# Altium project Thunderscope_Rev5.3.PrjPcb (part 1 of 3)
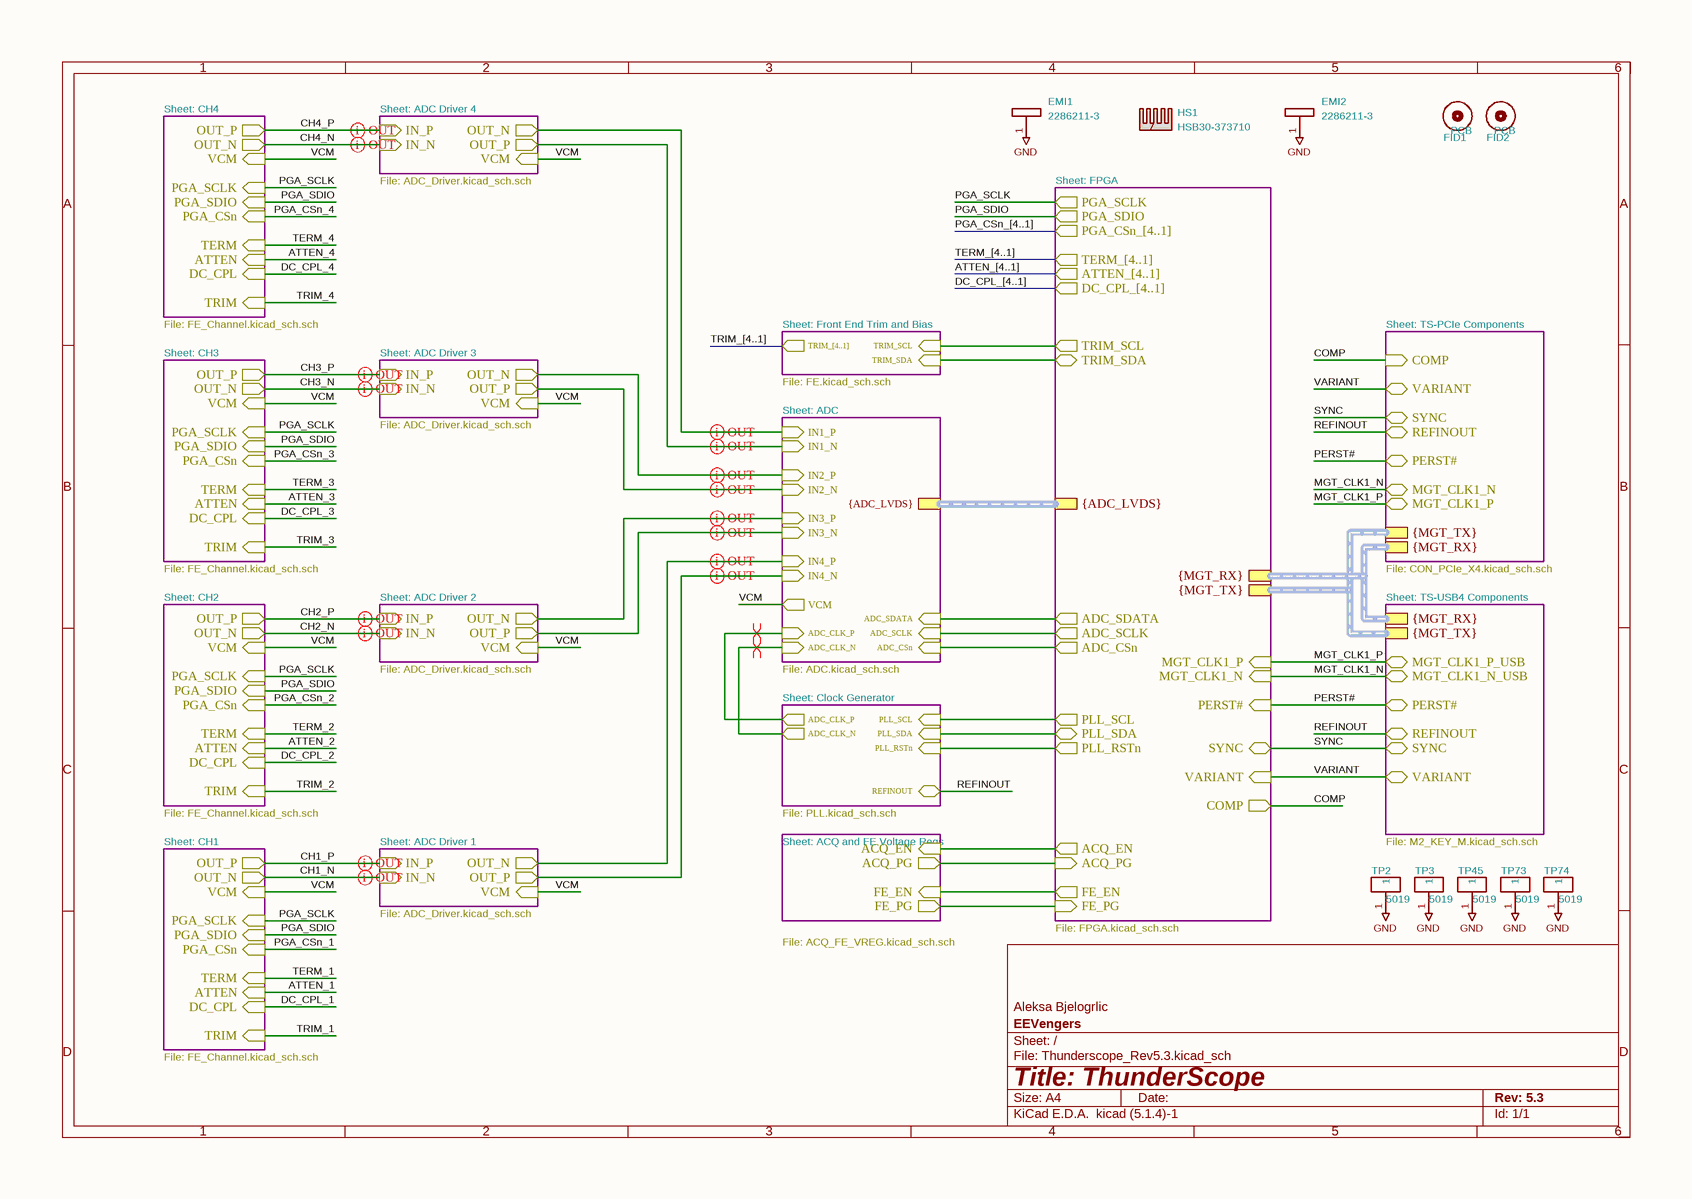
[diagram p0: Thunderscope_Rev5.3.SchDoc]
14 sheets, 945 parts. Net scope: hierarchical (ports join the sheet entries above them; power ports are global).
Board file: Thunderscope_Rev5.3.PcbDoc
Sheets:
  Thunderscope_Rev5.3.SchDoc
    CH3 = FE_Channel.SchDoc
    FPGA = FPGA.SchDoc
      FPGA Power Inputs = FPGA_PWR.SchDoc
      FPGA IO Banks = FPGA_Bank_IO.SchDoc
      FPGA Voltage Regs = FPGA_VREG.SchDoc
      FPGA Config and Transceivers = FPGA_CFG_MGT.SchDoc
    TS-USB4 Components = M2_KEY_M.SchDoc
    Clock Generator = PLL.SchDoc
    ADC Driver 1 = ADC_Driver.SchDoc
    ADC Driver 2 = ADC_Driver.SchDoc
    TS-PCIe Components = CON_PCIe_X4.SchDoc
    ADC = ADC.SchDoc
    Front End Trim and Bias = FE.SchDoc
    ADC Driver 3 = ADC_Driver.SchDoc
    CH4 = FE_Channel.SchDoc
    CH2 = FE_Channel.SchDoc
    ADC Driver 4 = ADC_Driver.SchDoc
    ACQ and FE Voltage Regs = ACQ_FE_VREG.SchDoc
    CH1 = FE_Channel.SchDoc

## Sheet Thunderscope_Rev5.3.SchDoc
size 297 x 209 mm

### Parts
EMI1  2286211-3  [TE_2286211-3]
EMI2  2286211-3  [TE_2286211-3]
FID1  PCB  [GEN_FID]
FID2  PCB  [GEN_FID]
HS1  HSB30-373710  [SSKY_HSB30-373710]  (mechanical)
TP2  5019  [KEY_5019]
TP3  5019  [KEY_5019]  (mechanical)
TP45  5019  [KEY_5019]  (mechanical)
TP73  5019  [KEY_5019]  (mechanical)
TP74  5019  [KEY_5019]  (mechanical)

### Sub-sheets
ACQ and FE Voltage Regs = ACQ_FE_VREG.SchDoc: FE_EN (in), ACQ_EN (in), FE_PG (out), ACQ_PG (out)
ADC = ADC.SchDoc: IN4_N (in), IN4_P (in), IN3_N (in), IN3_P (in), IN2_N (in), IN2_P (in), VCM (out), IN1_N (in), IN1_P (in), ADC_CSn (in), ADC_SDATA (in), ADC_SCLK (in), ADC_CLK_P (in), ADC_CLK_N (in), {ADC_LVDS} (harness ADC_LVDS)
ADC Driver 1 = ADC_Driver.SchDoc: VCM (in), OUT_N (out), OUT_P (out), IN_N (in), IN_P (in)
ADC Driver 2 = ADC_Driver.SchDoc: VCM (in), OUT_N (out), OUT_P (out), IN_N (in), IN_P (in)
ADC Driver 3 = ADC_Driver.SchDoc: VCM (in), OUT_N (out), OUT_P (out), IN_N (in), IN_P (in)
ADC Driver 4 = ADC_Driver.SchDoc: VCM (in), OUT_N (out), OUT_P (out), IN_N (in), IN_P (in)
CH1 = FE_Channel.SchDoc: OUT_P (out), VCM (in), OUT_N (out), TRIM (in), ATTEN (in), DC_CPL (in), PGA_CSn (in), PGA_SCLK (in), PGA_SDIO (in), TERM (in)
CH2 = FE_Channel.SchDoc: OUT_P (out), VCM (in), OUT_N (out), TRIM (in), ATTEN (in), DC_CPL (in), PGA_CSn (in), PGA_SCLK (in), PGA_SDIO (in), TERM (in)
CH3 = FE_Channel.SchDoc: OUT_P (out), VCM (in), OUT_N (out), TRIM (in), ATTEN (in), DC_CPL (in), PGA_CSn (in), PGA_SCLK (in), PGA_SDIO (in), TERM (in)
CH4 = FE_Channel.SchDoc: OUT_P (out), VCM (in), OUT_N (out), TRIM (in), ATTEN (in), DC_CPL (in), PGA_CSn (in), PGA_SCLK (in), PGA_SDIO (in), TERM (in)
Clock Generator = PLL.SchDoc: ADC_CLK_P (out), ADC_CLK_N (out), PLL_RSTn (in), PLL_SDA (in), PLL_SCL (in), REFINOUT (bidir)
FPGA = FPGA.SchDoc: PLL_RSTn (out), ADC_CSn (out), FE_EN (out), PGA_SDIO (out), PGA_SCLK (out), PLL_SCL (out), PLL_SDA (bidir), TRIM_SCL (out), TRIM_SDA (bidir), ADC_SDATA (out), ADC_SCLK (out), ACQ_EN (out), FE_PG (in), ACQ_PG (in), ATTEN_[4..1] (out), TERM_[4..1] (out), DC_CPL_[4..1] (out), PGA_CSn_[4..1] (out), SYNC (bidir), PERST# (in), MGT_CLK1_P (in), MGT_CLK1_N (in), VARIANT (in), COMP (out), {ADC_LVDS}, {MGT_TX}, {MGT_RX}
Front End Trim and Bias = FE.SchDoc: TRIM_SCL (in), TRIM_SDA (in), TRIM_[4..1] (out)
TS-PCIe Components = CON_PCIe_X4.SchDoc: PERST# (bidir), REFINOUT (bidir), SYNC (bidir), MGT_CLK1_N (bidir), MGT_CLK1_P (bidir), VARIANT (bidir), COMP (in), {MGT_RX} (harness MGT_RX), {MGT_TX} (harness MGT_TX)
TS-USB4 Components = M2_KEY_M.SchDoc: REFINOUT (bidir), SYNC (bidir), PERST# (bidir), MGT_CLK1_N_USB (bidir), MGT_CLK1_P_USB (bidir), VARIANT (bidir), {MGT_TX} (harness MGT_TX), {MGT_RX} (harness MGT_RX)

### Nets
GND: EMI1.1 EMI2.1 TP2.1 TP3.1 TP45.1 TP73.1 TP74.1
ACQ_EN: sheet FPGA/ACQ_EN, sheet ACQ and FE Voltage Regs/ACQ_EN
ACQ_PG: sheet FPGA/ACQ_PG, sheet ACQ and FE Voltage Regs/ACQ_PG
ADC_CLK_N: sheet Clock Generator/ADC_CLK_N, sheet ADC/ADC_CLK_N
ADC_CLK_P: sheet Clock Generator/ADC_CLK_P, sheet ADC/ADC_CLK_P
ADC_CSn: sheet FPGA/ADC_CSn, sheet ADC/ADC_CSn
ADC_SCLK: sheet FPGA/ADC_SCLK, sheet ADC/ADC_SCLK
ADC_SDATA: sheet FPGA/ADC_SDATA, sheet ADC/ADC_SDATA
CH1_N: sheet ADC Driver 1/IN_N, sheet CH1/OUT_N
CH1_P: sheet ADC Driver 1/IN_P, sheet CH1/OUT_P
CH2_N: sheet ADC Driver 2/IN_N, sheet CH2/OUT_N
CH2_P: sheet ADC Driver 2/IN_P, sheet CH2/OUT_P
CH3_N: sheet CH3/OUT_N, sheet ADC Driver 3/IN_N
CH3_P: sheet CH3/OUT_P, sheet ADC Driver 3/IN_P
CH4_N: sheet CH4/OUT_N, sheet ADC Driver 4/IN_N
CH4_P: sheet CH4/OUT_P, sheet ADC Driver 4/IN_P
COMP: sheet FPGA/COMP, sheet TS-PCIe Components/COMP
FE_EN: sheet FPGA/FE_EN, sheet ACQ and FE Voltage Regs/FE_EN
FE_PG: sheet FPGA/FE_PG, sheet ACQ and FE Voltage Regs/FE_PG
IN1_N: sheet ADC/IN1_N, sheet ADC Driver 4/OUT_P
IN1_P: sheet ADC/IN1_P, sheet ADC Driver 4/OUT_N
IN2_N: sheet ADC/IN2_N, sheet ADC Driver 3/OUT_P
IN2_P: sheet ADC/IN2_P, sheet ADC Driver 3/OUT_N
IN3_N: sheet ADC Driver 2/OUT_P, sheet ADC/IN3_N
IN3_P: sheet ADC Driver 2/OUT_N, sheet ADC/IN3_P
IN4_N: sheet ADC Driver 1/OUT_P, sheet ADC/IN4_N
IN4_P: sheet ADC Driver 1/OUT_N, sheet ADC/IN4_P
MGT_CLK1_N: sheet FPGA/MGT_CLK1_N, sheet TS-USB4 Components/MGT_CLK1_N_USB, sheet TS-PCIe Components/MGT_CLK1_N
MGT_CLK1_P: sheet FPGA/MGT_CLK1_P, sheet TS-USB4 Components/MGT_CLK1_P_USB, sheet TS-PCIe Components/MGT_CLK1_P
PERST#: sheet FPGA/PERST#, sheet TS-USB4 Components/PERST#, sheet TS-PCIe Components/PERST#
PGA_SCLK: sheet CH3/PGA_SCLK, sheet FPGA/PGA_SCLK, sheet CH4/PGA_SCLK, sheet CH2/PGA_SCLK, sheet CH1/PGA_SCLK
PGA_SDIO: sheet CH3/PGA_SDIO, sheet FPGA/PGA_SDIO, sheet CH4/PGA_SDIO, sheet CH2/PGA_SDIO, sheet CH1/PGA_SDIO
PLL_RSTn: sheet FPGA/PLL_RSTn, sheet Clock Generator/PLL_RSTn
PLL_SCL: sheet FPGA/PLL_SCL, sheet Clock Generator/PLL_SCL
PLL_SDA: sheet FPGA/PLL_SDA, sheet Clock Generator/PLL_SDA
REFINOUT: sheet TS-USB4 Components/REFINOUT, sheet Clock Generator/REFINOUT, sheet TS-PCIe Components/REFINOUT
SYNC: sheet FPGA/SYNC, sheet TS-USB4 Components/SYNC, sheet TS-PCIe Components/SYNC
TRIM_SCL: sheet FPGA/TRIM_SCL, sheet Front End Trim and Bias/TRIM_SCL
TRIM_SDA: sheet FPGA/TRIM_SDA, sheet Front End Trim and Bias/TRIM_SDA
VARIANT: sheet FPGA/VARIANT, sheet TS-USB4 Components/VARIANT, sheet TS-PCIe Components/VARIANT
VCM: sheet CH3/VCM, sheet ADC Driver 1/VCM, sheet ADC Driver 2/VCM, sheet ADC/VCM, sheet ADC Driver 3/VCM, sheet CH4/VCM, sheet CH2/VCM, sheet ADC Driver 4/VCM, sheet CH1/VCM

### Buses and harness runs
bus ATTEN_[4..1] = sheet FPGA/ATTEN_[4..1]
bus DC_CPL_[4..1] = sheet FPGA/DC_CPL_[4..1]
bus PGA_CSn_[4..1] = sheet FPGA/PGA_CSn_[4..1]
bus TERM_[4..1] = sheet FPGA/TERM_[4..1]
bus TRIM_[4..1] = sheet Front End Trim and Bias/TRIM_[4..1]
harness sheet ADC/{ADC_LVDS} = sheet FPGA/{ADC_LVDS}
harness sheet FPGA/{MGT_RX} = sheet TS-PCIe Components/{MGT_RX} = sheet TS-USB4 Components/{MGT_RX}
harness sheet FPGA/{MGT_TX} = sheet TS-PCIe Components/{MGT_TX} = sheet TS-USB4 Components/{MGT_TX}

### Layout directives
differential pair: ADC_CLK_N, ADC_CLK_P, IN1_N, IN1_P, IN2_N, IN2_P, IN3_N, IN3_P, IN4_N, IN4_P
differential pair; differential pair class 100Z_Diff_PGA: CH1_N, CH1_P, CH2_N, CH2_P, CH3_N, CH3_P, CH4_N, CH4_P

### Notes on the sheet
- Sheet: CH4
- Sheet: ADC Driver 4
- File: ADC_Driver.kicad_sch.sch
- Sheet: FPGA
- Sheet: CH3
- File: FE_Channel.kicad_sch.sch
- Sheet: ADC Driver 3
- Sheet: Front End Trim and Bias
- Sheet: TS-PCIe Components
- Sheet: ADC
- File: FE.kicad_sch.sch
- File: CON_PCIe_X4.kicad_sch.sch
- Sheet: CH2
- Sheet: ADC Driver 2
- Sheet: TS-USB4 Components
- Sheet: Clock Generator
- File: ADC.kicad_sch.sch
- Sheet: CH1
- Sheet: ADC Driver 1
- File: PLL.kicad_sch.sch
- Sheet: ACQ and FE Voltage Regs
- File: M2_KEY_M.kicad_sch.sch
- File: ACQ_FE_VREG.kicad_sch.sch
- File: FPGA.kicad_sch.sch
- 1
- 2
- 3
- 4
- 5
- 6
- A
- B
- C
- Aleksa Bjelogrlic
- D
- Title: ThunderScope
- File: Thunderscope_Rev5.3.kicad_sch
- Sheet: /
- EEVengers
- KiCad E.D.A.  kicad (5.1.4)-1
- Size: A4
- Date:
- Rev: 5.3
- Id: 1/1

### Library data of the parts
EMI1 EMI2 = EMI FINGER 2286211-3: MANUFACTURER: TE Connectivity; Substitutions Policy: No Substitutions; SUPPLIER 1: Mouser; SUPPLIER PART NUMBER 1: 571-2286211-3; MANUFACTURER PART NUMBER: 2286211-3; PACKAGE: Surface Mount; Footprint: Thunderscope_Rev5:TE_2286211-3; Value: 2286211-3
FID1 FID2 = FID 1mm: HOUSE PART NUMBER: Fiducial-1; Footprint: Thunderscope_Rev5:GEN_FID; Value: PCB
HS1 = HEATSINK HSB30-373710: MANUFACTURER: Same Sky; SUPPLIER 1: Mouser; SUPPLIER PART NUMBER 1: 179-HSB30-373710; MANUFACTURER PART NUMBER: HSB30-373710; Footprint: Thunderscope_Rev5:SSKY_HSB30-373710; Value: HSB30-373710
TP2 TP3 TP45 TP73 TP74 = TP KEYSTONE 5019: MANUFACTURER: Keystone Electronics; SUPPLIER 1: Mouser; SUPPLIER PART NUMBER 1: 534-5019; MANUFACTURER PART NUMBER: 5019; Footprint: Thunderscope_Rev5:KEY_5019; Value: 5019

## Sheet FE_Channel.SchDoc
size 420 x 297 mm
Used 4 times, as channels CH3, CH4, CH2, CH1. Parts and nets are listed once, with the designators drawn on the sheet.
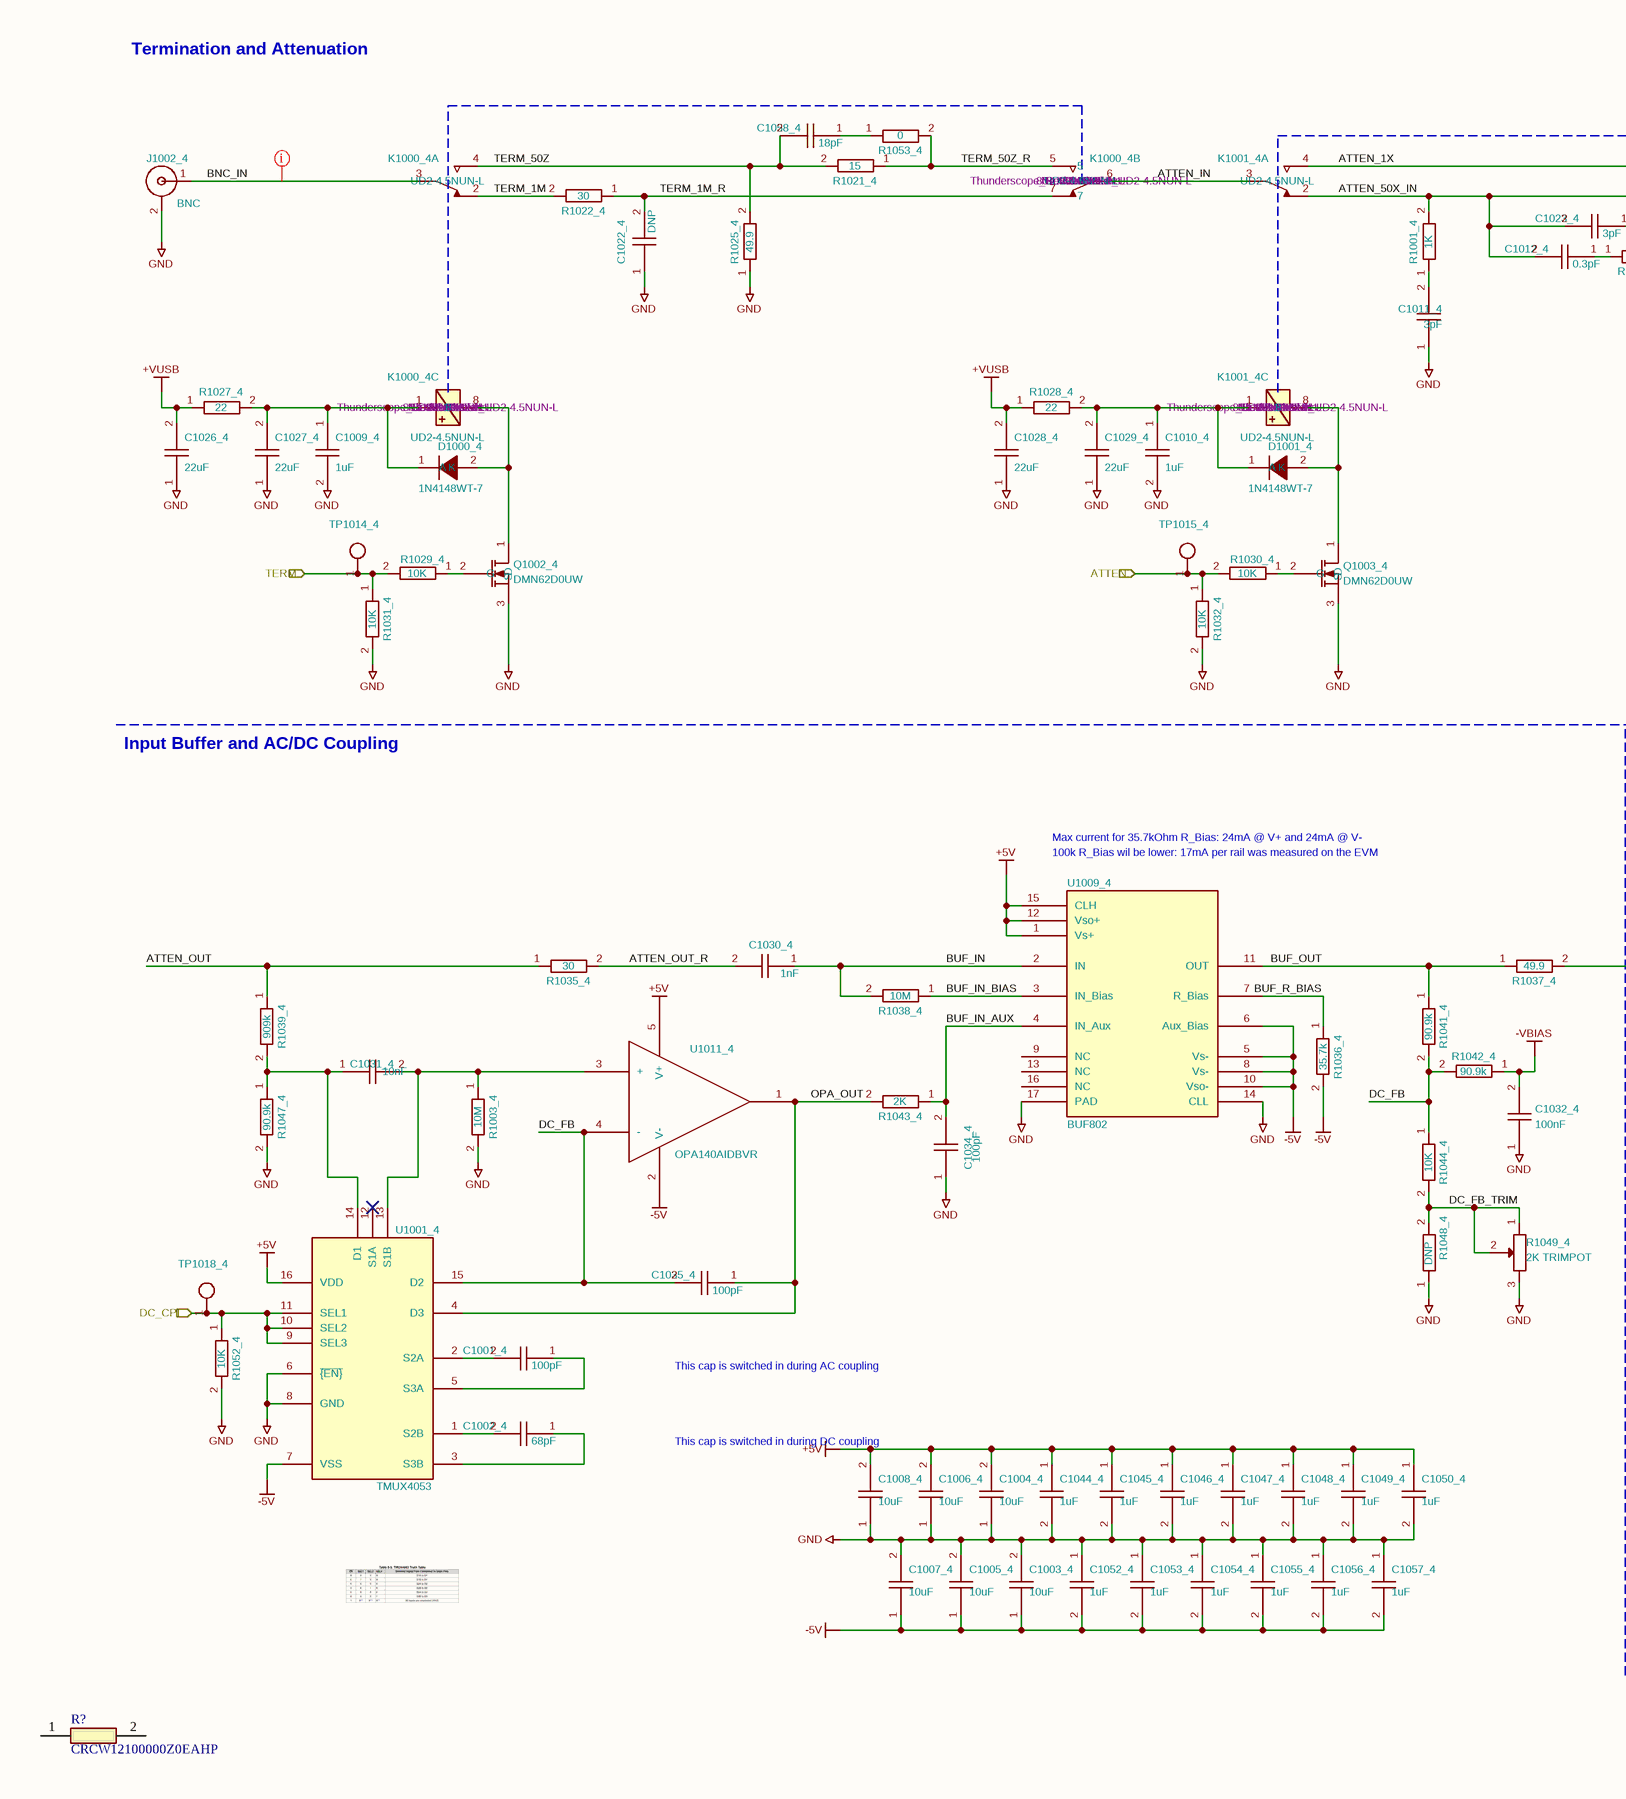
[diagram p1: FE_Channel.SchDoc, left]
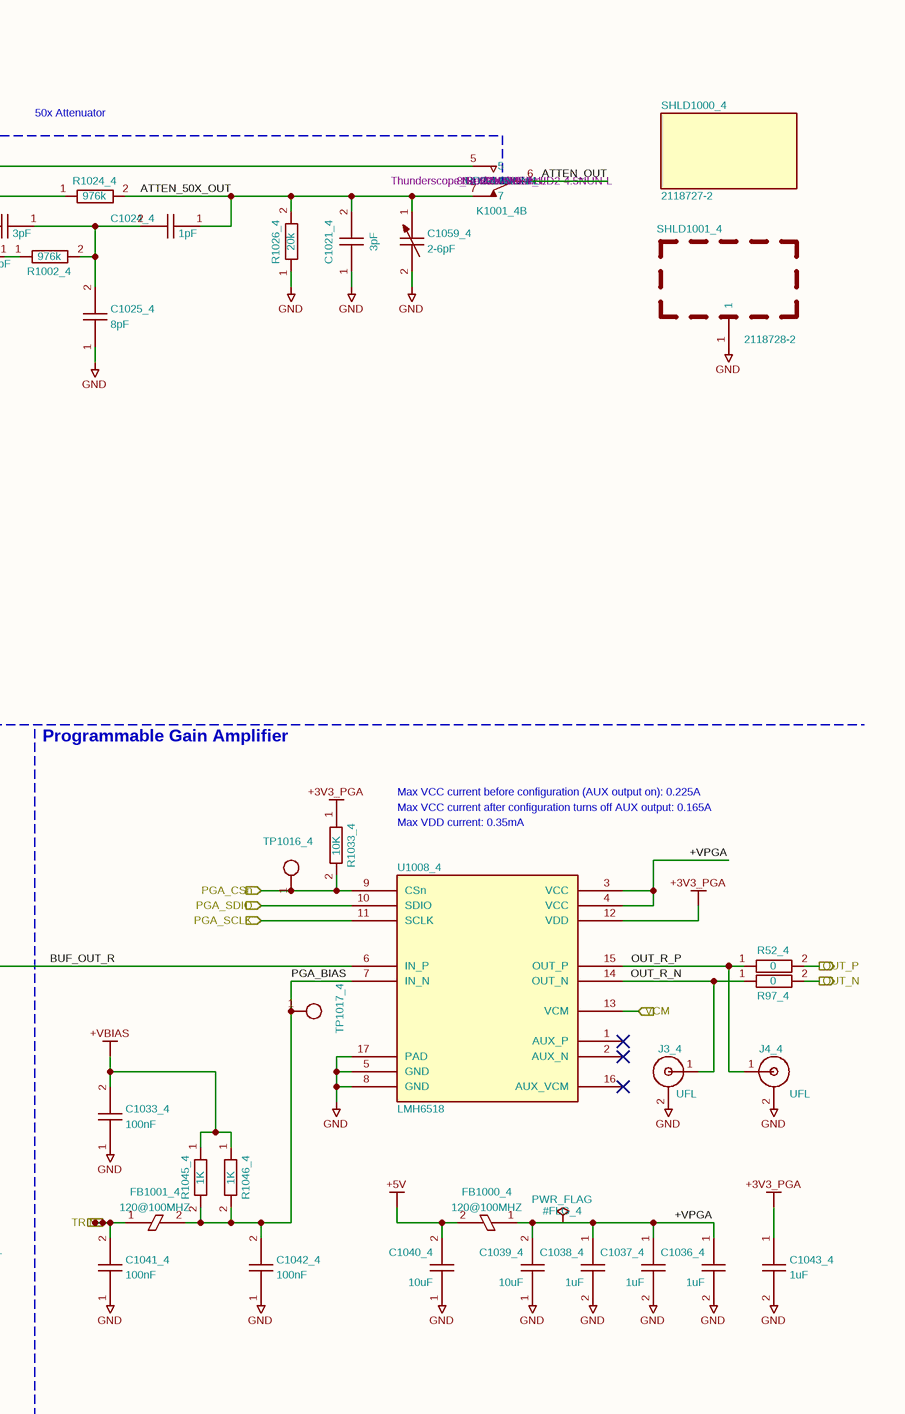
[diagram p2: FE_Channel.SchDoc, right]

### Parts
#FLG_4  PWR_FLAG  (graphical)
C1001_4  100pF  [GEN_C_0402]
C1002_4  68pF  [GEN_C_0402]
C1003_4  10uF  [GEN_C_0603]
C1004_4  10uF  [GEN_C_0603]
C1005_4  10uF  [GEN_C_0603]
C1006_4  10uF  [GEN_C_0603]
C1007_4  10uF  [GEN_C_0603]
C1008_4  10uF  [GEN_C_0603]
C1009_4  1uF  [GEN_C_0402]
C1010_4  1uF  [GEN_C_0402]
C1011_4  3pF  [GEN_C_0402]
C1012_4  0.3pF  [GEN_C_0402]
C1021_4  3pF  [GEN_C_0402]
C1022_4  DNP  [GEN_C_0603]
C1023_4  3pF  [GEN_C_0402]
C1024_4  1pF  [GEN_C_0402]
C1025_4  8pF  [GEN_C_0402]
C1026_4  22uF  [GEN_C_0805]
C1027_4  22uF  [GEN_C_0805]
C1028_4  22uF  [GEN_C_0805]
C1029_4  22uF  [GEN_C_0805]
C1030_4  1nF  [GEN_C_0603]
C1031_4  10nF  [GEN_C_0603]
C1032_4  100nF  [GEN_C_0402]
C1033_4  100nF  [GEN_C_0402]
C1034_4  100pF  [GEN_C_0402]
C1035_4  100pF  [GEN_C_0402]
C1036_4  1uF  [GEN_C_0402]
C1037_4  1uF  [GEN_C_0402]
C1038_4  1uF  [GEN_C_0402]
C1039_4  10uF  [GEN_C_0603]
C1040_4  10uF  [GEN_C_0603]
C1041_4  100nF  [GEN_C_0402]
C1042_4  100nF  [GEN_C_0402]
C1043_4  1uF  [GEN_C_0402]
C1044_4  1uF  [GEN_C_0402]
C1045_4  1uF  [GEN_C_0402]
C1046_4  1uF  [GEN_C_0402]
C1047_4  1uF  [GEN_C_0402]
C1048_4  1uF  [GEN_C_0402]
C1049_4  1uF  [GEN_C_0402]
C1050_4  1uF  [GEN_C_0402]
C1052_4  1uF  [GEN_C_0402]
C1053_4  1uF  [GEN_C_0402]
C1054_4  1uF  [GEN_C_0402]
C1055_4  1uF  [GEN_C_0402]
C1056_4  1uF  [GEN_C_0402]
C1057_4  1uF  [GEN_C_0402]
C1058_4  18pF  [GEN_C_0402]
C1059_4  2-6pF  [EW_TRIMCAP]
D1000_4  1N4148WT-7  [GEN_SOD_523]
D1001_4  1N4148WT-7  [GEN_SOD_523]
FB1000_4  120@100MHZ  [GEN_R_0402]
FB1001_4  120@100MHZ  [GEN_R_0402]
J3_4  UFL  [TE_2334884-1]
J4_4  UFL  [TE_2334884-1]
J1002_4  BNC  [DOSIN-801-0072]
K1000_4  UD2-4.5NUN-L  [KEMET_UD2-4.5NUN-L]  (parts A,B,C of 3)
K1001_4  UD2-4.5NUN-L  [KEMET_UD2-4.5NUN-L]  (parts A,B,C of 3)
Q1002_4  DMN62D0UW  [GEN_SOT_323]
Q1003_4  DMN62D0UW  [GEN_SOT_323]
R52_4  0  [GEN_R_0402]
R97_4  0  [GEN_R_0402]
R1001_4  1K  [GEN_R_0402]
R1002_4  976k  [GEN_R_0402]
R1003_4  10M  [GEN_R_0603]
R1021_4  15  [GEN_R_0603]
R1022_4  30  [GEN_R_0603]
R1024_4  976k  [GEN_R_0402]
R1025_4  49.9  [GEN_R_1206]
R1026_4  20k  [GEN_R_0402]
R1027_4  22  [GEN_R_0603]
R1028_4  22  [GEN_R_0603]
R1029_4  10K  [GEN_R_0402]
R1030_4  10K  [GEN_R_0402]
R1031_4  10K  [GEN_R_0402]
R1032_4  10K  [GEN_R_0402]
R1033_4  10K  [GEN_R_0402]
R1035_4  30  [GEN_R_0603]
R1036_4  35.7k  [GEN_R_0402]
R1037_4  49.9  [GEN_R_0402]
R1038_4  10M  [GEN_R_0603]
R1039_4  909k  [GEN_R_0402]
R1041_4  90.9k  [GEN_R_0402]
R1042_4  90.9k  [GEN_R_0402]
R1043_4  2K  [GEN_R_0402]
R1044_4  10K  [GEN_R_0402]
R1045_4  1K  [GEN_R_0402]
R1046_4  1K  [GEN_R_0402]
R1047_4  90.9k  [GEN_R_0402]
R1048_4  DNP  [GEN_R_0402]
R1049_4  2K TRIMPOT  [BOU_3mm_POT]
R1052_4  10K  [GEN_R_0402]
R1053_4  0  [GEN_R_0402]
R?  CRCW12100000Z0EAHP  [RESC3225X70N]
SHLD1000_4  2118727-2  (mechanical)
SHLD1001_4  2118728-2  [TE_2118728-2]
TP1014_4  PCB  [GEN_TP_PCB]  (value not drawn)
TP1015_4  PCB  [GEN_TP_PCB]  (value not drawn)
TP1016_4  PCB  [GEN_TP_PCB]  (value not drawn)
TP1017_4  PCB  [GEN_TP_PCB]  (value not drawn)
TP1018_4  PCB  [GEN_TP_PCB]  (value not drawn)
U1001_4  TMUX4053  [TI_TSOT-23-16_DYY0016A]
U1008_4  LMH6518  [TI_WQFN_RGH0016A]
U1009_4  BUF802  [TI_VQFN_RGT0016C]
U1011_4  OPA140AIDBVR  [GEN_SOT23_5_950_2900X1600X1450]

### Ports
ATTEN (in), DC_CPL (in), OUT_N (out), OUT_P (out), PGA_CSn (in), PGA_SCLK (in), PGA_SDIO (in), TERM (in), TRIM (in), VCM (in)

### Nets
+3V3_PGA: C1043_4.1 R1033_4.1 U1008_4.12(VDD)
+5V: C1004_4.2 C1006_4.2 C1008_4.2 C1040_4.2 C1044_4.1 C1045_4.1 C1046_4.1 C1047_4.1 C1048_4.1 C1049_4.1 C1050_4.1 FB1000_4.2 U1001_4.16(VDD) U1009_4.1(Vs+) U1009_4.12(Vso+) U1009_4.15(CLH) U1011_4.5(V+)
+VBIAS: C1033_4.2 R1045_4.1 R1046_4.1
+VUSB: C1026_4.2 C1028_4.2 R1027_4.1 R1028_4.1
-5V: C1003_4.1 C1005_4.1 C1007_4.1 C1052_4.2 C1053_4.2 C1054_4.2 C1055_4.2 C1056_4.2 C1057_4.2 R1036_4.2 U1001_4.7(VSS) U1009_4.5(Vs-) U1009_4.6(Aux_Bias) U1009_4.8(Vs-) U1009_4.10(Vso-) U1011_4.2(V-)
-VBIAS: C1032_4.2 R1042_4.1
GND: C1003_4.2 C1004_4.1 C1005_4.2 C1006_4.1 C1007_4.2 C1008_4.1 C1009_4.2 C1010_4.2 C1011_4.1 C1021_4.1 C1022_4.1 C1025_4.1 C1026_4.1 C1027_4.1 C1028_4.1 C1029_4.1 C1032_4.1 C1033_4.1 C1034_4.1 C1036_4.2 C1037_4.2 C1038_4.2 C1039_4.1 C1040_4.1 C1041_4.1 C1042_4.1 C1043_4.2 C1044_4.2 C1045_4.2 C1046_4.2 C1047_4.2 C1048_4.2 C1049_4.2 C1050_4.2 C1052_4.1 C1053_4.1 C1054_4.1 C1055_4.1 C1056_4.1 C1057_4.1 C1059_4.2 J3_4.2(SHIELD) J4_4.2(SHIELD) J1002_4.2(SHIELD) Q1002_4.3(S) Q1003_4.3(S) R1003_4.2 R1025_4.1 R1026_4.1 R1031_4.2 R1032_4.2 R1047_4.2 R1048_4.1 R1049_4.3 R1052_4.2 SHLD1001_4.1 U1001_4.6(~{{EN}}) U1001_4.8(GND) U1008_4.5(GND) U1008_4.8(GND) U1008_4.17(PAD) U1009_4.14(CLL) U1009_4.17(PAD)
+VPGA: #FLG_4.1 C1036_4.1 C1037_4.1 C1038_4.1 C1039_4.2 FB1000_4.1 U1008_4.3(VCC) U1008_4.4(VCC)
ATTEN: R1030_4.2 R1032_4.1 TP1015_4.1 ; port ATTEN
ATTEN_1X: K1001_4.4 K1001_4.5
ATTEN_50X_IN: C1012_4.2 C1023_4.2 K1001_4.2 R1001_4.2 R1024_4.1
ATTEN_50X_OUT: C1021_4.2 C1024_4.1 C1059_4.1 K1001_4.7 R1024_4.2 R1026_4.2
ATTEN_IN: K1000_4.6 K1001_4.3
ATTEN_OUT: K1001_4.6 R1035_4.1 R1039_4.1
ATTEN_OUT_R: C1030_4.2 R1035_4.2
BNC_IN: J1002_4.1(Signal) K1000_4.3
BUF_IN: C1030_4.1 R1038_4.2 U1009_4.2(IN)
BUF_IN_AUX: C1034_4.2 R1043_4.1 U1009_4.4(IN_Aux)
BUF_IN_BIAS: R1038_4.1 U1009_4.3(IN_Bias)
BUF_OUT: R1037_4.1 R1041_4.1 U1009_4.11(OUT)
BUF_OUT_R: R1037_4.2 U1008_4.6(IN_P)
BUF_R_BIAS: R1036_4.1 U1009_4.7(R_Bias)
DC_CPL: R1052_4.1 TP1018_4.1 U1001_4.9(SEL3) U1001_4.10(SEL2) U1001_4.11(SEL1) ; port DC_CPL
DC_FB: C1035_4.2 R1041_4.2 R1042_4.2 R1044_4.1 U1001_4.15(D2) U1011_4.4(-)
DC_FB_TRIM: R1044_4.2 R1048_4.2 R1049_4.1 R1049_4.2
OPA_OUT: C1035_4.1 R1043_4.2 U1001_4.4(D3) U1011_4.1(OUT)
OUT_N: R97_4.2 ; port OUT_N
OUT_P: R52_4.2 ; port OUT_P
OUT_R_N: J3_4.1(Signal) R97_4.1 U1008_4.14(OUT_N)
OUT_R_P: J4_4.1(Signal) R52_4.1 U1008_4.15(OUT_P)
PGA_BIAS: C1042_4.2 FB1001_4.2 R1045_4.2 R1046_4.2 TP1017_4.1 U1008_4.7(IN_N)
PGA_CSn: R1033_4.2 TP1016_4.1 U1008_4.9(CSn) ; port PGA_CSn
PGA_SCLK: U1008_4.11(SCLK) ; port PGA_SCLK
PGA_SDIO: U1008_4.10(SDIO) ; port PGA_SDIO
TERM: R1029_4.2 R1031_4.1 TP1014_4.1 ; port TERM
TERM_1M: K1000_4.2 R1022_4.2
TERM_1M_R: C1022_4.2 K1000_4.7 R1022_4.1
TERM_50Z: C1058_4.2 K1000_4.4 R1021_4.2 R1025_4.2
TERM_50Z_R: K1000_4.5 R1021_4.1 R1053_4.2
TRIM: C1041_4.2 FB1001_4.1 ; port TRIM
VCM: U1008_4.13(VCM) ; port VCM
NetC1001_4_1: C1001_4.1 U1001_4.5(S3A)
NetC1001_4_2: C1001_4.2 U1001_4.2(S2A)
NetC1002_4_1: C1002_4.1 U1001_4.3(S3B)
NetC1002_4_2: C1002_4.2 U1001_4.1(S2B)
NetC1009_4_1: C1009_4.1 C1027_4.2 D1000_4.1(K) K1000_4.1 R1027_4.2
NetC1010_4_1: C1010_4.1 C1029_4.2 D1001_4.1(K) K1001_4.1 R1028_4.2
NetC1011_4_2: C1011_4.2 R1001_4.1
NetC1012_4_1: C1012_4.1 R1002_4.1
NetC1023_4_1: C1023_4.1 C1024_4.2 C1025_4.2 R1002_4.2
NetC1031_4_1: C1031_4.1 R1039_4.2 R1047_4.1 U1001_4.14(D1)
NetC1031_4_2: C1031_4.2 R1003_4.1 U1001_4.13(S1B) U1011_4.3(+)
NetC1058_4_1: C1058_4.1 R1053_4.1
NetD1000_4_2: D1000_4.2(A) K1000_4.8 Q1002_4.1(D)
NetD1001_4_2: D1001_4.2(A) K1001_4.8 Q1003_4.1(D)
NetQ1002_4_2: Q1002_4.2(G) R1029_4.1
NetQ1003_4_2: Q1003_4.2(G) R1030_4.1

Not connected (* = marked no-connect by the designer): R? 1 2; U1001_4 12(S1A)*; U1008_4 1(AUX_P)* 2(AUX_N)* 16(AUX_VCM)*; U1009_4 9(NC) 13(NC) 16(NC)

### Channels
CH3: designators end in _CH3; ports ATTEN=ATTEN_3 DC_CPL=DC_CPL_3 OUT_N=CH3_N OUT_P=CH3_P PGA_CSn=PGA_CSn_3 PGA_SCLK=PGA_SCLK PGA_SDIO=PGA_SDIO TERM=TERM_3 TRIM=TRIM_3 VCM=VCM
CH4: designators end in _CH4; ports ATTEN=ATTEN_4 DC_CPL=DC_CPL_4 OUT_N=CH4_N OUT_P=CH4_P PGA_CSn=PGA_CSn_4 PGA_SCLK=PGA_SCLK PGA_SDIO=PGA_SDIO TERM=TERM_4 TRIM=TRIM_4 VCM=VCM
CH2: designators end in _CH2; ports ATTEN=ATTEN_2 DC_CPL=DC_CPL_2 OUT_N=CH2_N OUT_P=CH2_P PGA_CSn=PGA_CSn_2 PGA_SCLK=PGA_SCLK PGA_SDIO=PGA_SDIO TERM=TERM_2 TRIM=TRIM_2 VCM=VCM
CH1: designators end in _CH1; ports ATTEN=ATTEN_1 DC_CPL=DC_CPL_1 OUT_N=CH1_N OUT_P=CH1_P PGA_CSn=PGA_CSn_1 PGA_SCLK=PGA_SCLK PGA_SDIO=PGA_SDIO TERM=TERM_1 TRIM=TRIM_1 VCM=VCM

### Layout directives
net class 50Z: BNC_IN_CH3

### Notes on the sheet
- Termination and Attenuation
- 50x Attenuator
- Input Buffer and AC/DC Coupling
- Programmable Gain Amplifier
- Max current for 35.7kOhm R_Bias: 24mA @ V+ and 24mA @ V-
- (near U1009_4) 100k R_Bias wil be lower: 17mA per rail was measured on the EVM
- Max VDD current: 0.35mA
- Max VCC current before configuration (AUX output on): 0.225A
- Max VCC current after configuration turns off AUX output: 0.165A
- This cap is switched in
  during AC coupling
- This cap is switched in
  during DC coupling
- 1
- 2
- 3
- 4
- 5
- 6
- 7
- 8
- A
- B
- C
- D
- E
- Aleksa Bjelogrlic
- Title: ThunderScope
- File: FE_Channel.kicad_sch
- Sheet: /
- EEVengers
- F
- KiCad E.D.A.  kicad (5.1.4)-1
- Size: A3
- Date:
- Rev: 5.3
- Id: 1/1

### Library data of the parts
C1001_4 C1034_4 C1035_4 = CAP 100pF 50V C0G 0402: MANUFACTURER: Murata; MANUFACTURER PART NUMBER: GCM1555C1H101FA16D; TEMPERATURE COEFFICIENT: C0G; VOLTAGE RATING: 50V; Substitutions Policy: Any Parametric Equivalent; PACKAGE: 0402; SUPPLIER 1: Mouser; SUPPLIER PART NUMBER 1: 81-GCM1555C1H101FA6D; Value: 100pF; Footprint: Thunderscope_Rev5:GEN_C_0402
C1002_4 = CAP 68pF 50V C0G 0402: MANUFACTURER: Murata; MANUFACTURER PART NUMBER: GCM1555C1H680FA16J; TEMPERATURE COEFFICIENT: C0G; VOLTAGE RATING: 50V; Substitutions Policy: Any Parametric Equivalent; PACKAGE: 0402; SUPPLIER 1: Mouser; SUPPLIER PART NUMBER 1: 81-GCM1555C1H680FA6J; Value: 68pF; Footprint: Thunderscope_Rev5:GEN_C_0402
C1003_4 C1004_4 C1005_4 C1006_4 C1007_4 C1008_4 C1039_4 C1040_4 = CAP 10uF 25V X5R 0603: MANUFACTURER: Murata; MANUFACTURER PART NUMBER: GRM188R61E106MA73D; VOLTAGE RATING: 25V; Substitutions Policy: Any Parametric Equivalent; PACKAGE: 0402; SUPPLIER 1: Mouser; SUPPLIER PART NUMBER 1: 81-GRM188R61E106MA3D; Value: 10uF; Footprint: Thunderscope_Rev5:GEN_C_0603
C1009_4 C1010_4 C1036_4 C1037_4 C1038_4 C1043_4 C1044_4 C1045_4 C1046_4 C1047_4 C1048_4 C1049_4 C1050_4 C1052_4 C1053_4 C1054_4 C1055_4 C1056_4 C1057_4 = CAP 1uF 25V X5R 0402: MANUFACTURER: Murata; MANUFACTURER PART NUMBER: GRM155R61E105KA12D; VOLTAGE RATING: 25V; Substitutions Policy: Any Parametric Equivalent; PACKAGE: 0402; SUPPLIER 1: Mouser; SUPPLIER PART NUMBER 1: 81-GRM155R61E105KA2D; Value: 1uF; Footprint: Thunderscope_Rev5:GEN_C_0402
C1011_4 C1023_4 = CAP 3pF 200V C0G 0402: MANUFACTURER: KEMET; MANUFACTURER PART NUMBER: CBR04C309B2GAC; VOLTAGE RATING: 200V; Substitutions Policy: No Substitutions; TEMPERATURE COEFFICIENT: C0G; PACKAGE: 0402; SUPPLIER 1: Mouser; SUPPLIER PART NUMBER 1: 80-CBR04C309B2GAC; Value: 3pF; Footprint: Thunderscope_Rev5:GEN_C_0402
C1012_4 = CAP 0.3pF 100V Thin Film 0402: MANUFACTURER: KYOCERA AVX; MANUFACTURER PART NUMBER: 04021J0R3ZBSTR; VOLTAGE RATING: 100V; Substitutions Policy: No Substitutions; PACKAGE: 0402; SUPPLIER 1: Mouser; SUPPLIER PART NUMBER 1: 581-04021J0R3ZBSTR; Value: 0.3pF; Footprint: Thunderscope_Rev5:GEN_C_0402
C1021_4 = CAP 3pF 200V C0G 0402: MANUFACTURER: KEMET; MANUFACTURER PART NUMBER: CBR04C309B2GAC; VOLTAGE RATING: 200V; TEMPERATURE COEFFICIENT: C0G; Substitutions Policy: No Substitutions; PACKAGE: 0402; SUPPLIER 1: Mouser; SUPPLIER PART NUMBER 1: 80-CBR04C309B2GAC; Value: 3pF; Footprint: Thunderscope_Rev5:GEN_C_0402
C1022_4 = CAP DNP 0603: PACKAGE: 0603; Value: DNP; Footprint: Thunderscope_Rev5:GEN_C_0603
C1024_4 = CAP 1pF 50V C0G 0402: MANUFACTURER: KEMET; MANUFACTURER PART NUMBER: CBR04C109A5GAC; VOLTAGE RATING: 50V; Substitutions Policy: No Substitutions; PACKAGE: 0402; SUPPLIER 1: Mouser; SUPPLIER PART NUMBER 1: 80-CBR04C109A5GAC; Value: 1pF; Footprint: Thunderscope_Rev5:GEN_C_0402
C1025_4 = CAP 8pF 50V C0G 0402: MANUFACTURER: KEMET; MANUFACTURER PART NUMBER: CBR04C809B5GAC; VOLTAGE RATING: 50V; TEMPERATURE COEFFICIENT: C0G; Substitutions Policy: No Substitutions; PACKAGE: 0402; SUPPLIER 1: Mouser; SUPPLIER PART NUMBER 1: 80-CBR04C809B5GAC; Value: 8pF; Footprint: Thunderscope_Rev5:GEN_C_0402
C1026_4 C1027_4 C1028_4 C1029_4 = CAP 22uF 25V X5R 0805: HOUSE PART NUMBER: C-22uF-0805-002; MANUFACTURER: Murata; MANUFACTURER PART NUMBER: GRM21BR61E226ME44L; VOLTAGE RATING: 25V; Substitutions Policy: Any Parametric Equivalent; PACKAGE: 0805; SUPPLIER 1: Mouser; SUPPLIER PART NUMBER 1: 81-GRM21BR61E226ME4L; Value: 22uF; Footprint: Thunderscope_Rev5:GEN_C_0805
C1030_4 = CAP 1nF 100V C0G 0603: MANUFACTURER: Murata; MANUFACTURER PART NUMBER: GCM1885C2A102FA16D; VOLTAGE RATING: 100V; TEMPERATURE COEFFICIENT: C0G; Substitutions Policy: ECO Required for Substitution; PACKAGE: 0603; SUPPLIER 1: Mouser; SUPPLIER PART NUMBER 1: 81-GCM1885C2A102FA6D; Value: 1nF; Footprint: Thunderscope_Rev5:GEN_C_0603
C1031_4 = CAP 10nF 50V C0G 0603: MANUFACTURER: Murata; MANUFACTURER PART NUMBER: GRM1885C1H103JA01J; VOLTAGE RATING: 50V; Substitutions Policy: ECO Required for Substitution; PACKAGE: 0603; SUPPLIER 1: Mouser; SUPPLIER PART NUMBER 1: 81-GRM1885C1H103JA1J; Value: 10nF; Footprint: Thunderscope_Rev5:GEN_C_0603
C1032_4 C1033_4 C1041_4 C1042_4 = CAP 100nF 16V X7R 0402: HOUSE PART NUMBER: C-100nF-0402-002; MANUFACTURER: Murata; MANUFACTURER PART NUMBER: GCM155R71C104KA55D; VOLTAGE RATING: 16V; Substitutions Policy: Any Parametric Equivalent; PACKAGE: 0402; SUPPLIER 1: Mouser; SUPPLIER PART NUMBER 1: 81-GCM155R71C104KA5D; Value: 100nF; Footprint: Thunderscope_Rev5:GEN_C_0402
C1058_4 = CAP 18pF 50V C0G 0402: MANUFACTURER: KEMET; MANUFACTURER PART NUMBER: CBR04C180F5GAC; VOLTAGE RATING: 50V; TEMPERATURE COEFFICIENT: C0G; Substitutions Policy: No Substitutions; PACKAGE: 0402; SUPPLIER 1: Mouser; SUPPLIER PART NUMBER 1: 80-CBR04C180F5G; Value: 18pF; Footprint: Thunderscope_Rev5:GEN_C_0402
C1059_4 = CAP TRIMMER 2-6PF 100V: MANUFACTURER: EW Electronics; MANUFACTURER PART NUMBER: SGC3S060; Substitutions Policy: ECO Required for Substitution; SUPPLIER 1: Digikey; SUPPLIER PART NUMBER 1: 2447-SGC3S060CT-ND; PACKAGE: 2-SMD (4.5x3.2mm); Value: 2-6pF; Footprint: Thunderscope_Rev5:EW_TRIMCAP
D1000_4 D1001_4 = DIODE 1N4148: MANUFACTURER: Diodes; Substitutions Policy: ECO Required for Substitution; SUPPLIER 1: Mouser; SUPPLIER PART NUMBER 1: 621-1N4148WT; MANUFACTURER PART NUMBER: 1N4148WT-7; PACKAGE: SOD-523; Value: 1N4148WT-7; Footprint: Thunderscope_Rev5:GEN_SOD_523
FB1000_4 FB1001_4 = FERRITE BEAD 120 OHM 0402: HOUSE PART NUMBER: BLM15PX121SN1D; MANUFACTURER: Murata; Substitutions Policy: No Substitutions; SUPPLIER 1: Mouser; SUPPLIER PART NUMBER 1: 81-BLM15PX121SN1D; MANUFACTURER PART NUMBER: BLM15PX121SN1D; PACKAGE: 0402; Value: 120@100MHZ; Footprint: Thunderscope_Rev5:GEN_R_0402
J3_4 J4_4 = UFL Jack SMD: MANUFACTURER: TE Connectivity; MANUFACTURER PART NUMBER: 2334884-1; SUPPLIER 1: Mouser; SUPPLIER PART NUMBER 1: 571-2334884-1; PACKAGE: Surface Mount; Value: UFL; Footprint: Thunderscope_Rev5:TE_2334884-1
J1002_4 = BNC JACK R/A: MANUFACTURER: Molex; MANUFACTURER PART NUMBER: 73100-0105; Substitutions Policy: No Substitutions; SUPPLIER 1: Mouser; SUPPLIER PART NUMBER 1: 538-73100-0105; PACKAGE: Through Hole; Value: BNC; Footprint: Thunderscope_Rev5:MOL_0731000105
K1000_4 K1001_4 = RELAY DPDT-NO UD2-4.5NUN-L: MANUFACTURER: KEMET; Substitutions Policy: No Substitutions; MANUFACTURER PART NUMBER: UD2-4.5NUN-L; SUPPLIER 1: Mouser; SUPPLIER PART NUMBER 1: 80-UD2-4.5NUN-L; PACKAGE: Surface Mount; Value: UD2-4.5NUN-L; Footprint: Thunderscope_Rev5:KEMET_UD2-4.5NUN-L
Q1002_4 Q1003_4 = NMOS DMN62D0UW: HOUSE PART NUMBER: DMN62D0UW-7; MANUFACTURER: Diodes; VDSS: 60V; Substitutions Policy: ECO Required for Substitution; SUPPLIER 1: Mouser; SUPPLIER PART NUMBER 1: 621-DMN62D0UW-7; MANUFACTURER PART NUMBER: DMN62D0UW-7; PACKAGE: SOT-323; Value: DMN62D0UW; Footprint: Thunderscope_Rev5:GEN_SOT_323
R52_4 R97_4 R1053_4 = RES 0 OHM 1/16W 0402: MANUFACTURER: Yageo; MANUFACTURER PART NUMBER: RC0402JR-070RL; Substitutions Policy: Any Parametric Equivalent; PACKAGE: 0402; SUPPLIER 1: Mouser; SUPPLIER PART NUMBER 1: 603-RC0402JR-070RL; Value: 0; Footprint: Thunderscope_Rev5:GEN_R_0402
R1001_4 R1045_4 R1046_4 = RES 1K OHM 1% 1/10W 0402: HOUSE PART NUMBER: R-1K-0402-1%-001; MANUFACTURER: Yageo; MANUFACTURER PART NUMBER: RC0402FR-071KL; TOLERANCE: 1%; Substitutions Policy: Any Parametric Equivalent; PACKAGE: 0402; SUPPLIER 1: Mouser; SUPPLIER PART NUMBER 1: 603-RC0402FR-071KL; Value: 1K; Footprint: Thunderscope_Rev5:GEN_R_0402
R1002_4 R1024_4 = RES 976k OHM 1% 1/10W 0402: MANUFACTURER: KOA Speer; MANUFACTURER PART NUMBER: RK73H1ETTP9763F; TOLERANCE: 1%; Substitutions Policy: ECO Required for Substitution; PACKAGE: 0402; SUPPLIER 1: Mouser; SUPPLIER PART NUMBER 1: 660-RK73H1ETTP9763F; Value: 976k; Footprint: Thunderscope_Rev5:GEN_R_0402
R1003_4 R1038_4 = RES 10M OHM 1% 1/10W 0603: MANUFACTURER: KOA Speer; MANUFACTURER PART NUMBER: RK73H1JTTD1005F; TOLERANCE: 1%; Substitutions Policy: No Substitutions; PACKAGE: 0603; SUPPLIER 1: Mouser; SUPPLIER PART NUMBER 1: 660-RK73H1JTTD1005F; Value: 10M; Footprint: Thunderscope_Rev5:GEN_R_0603
R1021_4 = RES 15 OHM 1% 1/3W 0603: MANUFACTURER: KOA Speer; MANUFACTURER PART NUMBER: SG73P1JTTD15R0F; TOLERANCE: 1%; Substitutions Policy: No Substitutions; PACKAGE: 0603; SUPPLIER 1: Mouser; SUPPLIER PART NUMBER 1: 660-SG73P1JTTD15R0F; Value: 15; Footprint: Thunderscope_Rev5:GEN_R_0603
R1022_4 R1035_4 = RES 30 OHM 1% 1/3W 0603: MANUFACTURER: KOA Speer; MANUFACTURER PART NUMBER: SG73P1JTTD30R0F; TOLERANCE: 1%; Substitutions Policy: No Substitutions; PACKAGE: 0603; SUPPLIER 1: Mouser; SUPPLIER PART NUMBER 1: 660-SG73P1JTTD30R0F; Value: 30; Footprint: Thunderscope_Rev5:GEN_R_0603
R1025_4 = RES 49.9 OHM 1% 1W 0508: MANUFACTURER: KOA Speer; MANUFACTURER PART NUMBER: WK73R2ATTD49R9F; TOLERANCE: 1%; POWER RATING: 1W; Substitutions Policy: No Substitutions; PACKAGE: 0508; SUPPLIER 1: Mouser; SUPPLIER PART NUMBER 1: 660-WK73R2ATTD49R9F; Value: 49.9; Footprint: Thunderscope_Rev5:GEN_R_0508
R1026_4 = RES 20K OHM 1% 1/16W 0402: MANUFACTURER: Yageo; MANUFACTURER PART NUMBER: RC0402FR-0720KL; TOLERANCE: 1%; Substitutions Policy: Any Parametric Equivalent; PACKAGE: 0402; SUPPLIER 1: Mouser; SUPPLIER PART NUMBER 1: 603-RC0402FR-0720KL; Value: 20k; Footprint: Thunderscope_Rev5:GEN_R_0402
R1027_4 R1028_4 = RES 22 OHM 1% 1/3W 0603: MANUFACTURER: KOA Speer; MANUFACTURER PART NUMBER: SG73P1JTTD22R0F; TOLERANCE: 1%; Substitutions Policy: No Substitutions; PACKAGE: 0603; SUPPLIER 1: Mouser; SUPPLIER PART NUMBER 1: 660-SG73P1JTTD22R0F; Value: 22; Footprint: Thunderscope_Rev5:GEN_R_0603
R1029_4 R1030_4 R1031_4 R1032_4 R1033_4 R1044_4 R1052_4 = RES 10K OHM 1% 1/16W 0402: MANUFACTURER: Yageo; MANUFACTURER PART NUMBER: RC0402FR-0710KL; TOLERANCE: 1%; Substitutions Policy: Any Parametric Equivalent; PACKAGE: 0402; SUPPLIER 1: Mouser; SUPPLIER PART NUMBER 1: 603-RC0402FR-0710KL; Value: 10K; Footprint: Thunderscope_Rev5:GEN_R_0402
R1036_4 = RES 35.7K OHM 1% 1/16W 0402: MANUFACTURER: Yageo; MANUFACTURER PART NUMBER: RC0402FR-0735K7L; TOLERANCE: 1%; Substitutions Policy: Any Parametric Equivalent; PACKAGE: 0402; SUPPLIER 1: Mouser; SUPPLIER PART NUMBER 1: 603-RC0402FR-0735K7L; Value: 35.7k; Footprint: Thunderscope_Rev5:GEN_R_0402
R1037_4 = RES 49.9 OHM 1% 1/10W 0402: MANUFACTURER: Yageo; MANUFACTURER PART NUMBER: RC0402FR-0749R9L; TOLERANCE: 1%; Substitutions Policy: Any Parametric Equivalent; PACKAGE: 0402; SUPPLIER 1: Mouser; SUPPLIER PART NUMBER 1: 603-RC0402FR-0749R9L; Value: 49.9; Footprint: Thunderscope_Rev5:GEN_R_0402
R1039_4 = RES 909K OHM 1% 1/16W 0402: MANUFACTURER: Yageo; MANUFACTURER PART NUMBER: RC0402FR-07909KL; TOLERANCE: 1%; Substitutions Policy: Any Parametric Equivalent; PACKAGE: 0402; SUPPLIER 1: Mouser; SUPPLIER PART NUMBER 1: 603-RC0402FR-07909KL; Value: 909k; Footprint: Thunderscope_Rev5:GEN_R_0402
R1041_4 R1042_4 R1047_4 = RES 90.9K OHM 1% 1/16W 0402: MANUFACTURER: Yageo; MANUFACTURER PART NUMBER: RC0402FR-0790K9L; TOLERANCE: 1%; Substitutions Policy: Any Parametric Equivalent; PACKAGE: 0402; SUPPLIER 1: Mouser; SUPPLIER PART NUMBER 1: 603-RC0402FR-0790K9L; Value: 90.9k; Footprint: Thunderscope_Rev5:GEN_R_0402
R1043_4 = RES 2K OHM 1% 1/16W 0402: MANUFACTURER: Yageo; MANUFACTURER PART NUMBER: RC0402FR-072KL; TOLERANCE: 1%; Substitutions Policy: Any Parametric Equivalent; PACKAGE: 0402; SUPPLIER 1: Mouser; SUPPLIER PART NUMBER 1: 603-RC0402FR-072KL; Value: 2K; Footprint: Thunderscope_Rev5:GEN_R_0402
R1048_4 = RES DNP 0402: TOLERANCE: 1%; PACKAGE: 0402; Value: DNP; Footprint: Thunderscope_Rev5:GEN_R_0402
R1049_4 = TRIMMER 2K OHM 0.1W J LEAD TOP: MANUFACTURER: Bourns; MANUFACTURER PART NUMBER: TC33X-2-202E; TOLERANCE: 1%; Substitutions Policy: ECO Required for Substitution; SUPPLIER 1: Mouser; SUPPLIER PART NUMBER 1: 652-TC33X-2-202E; PACKAGE: 2-SMD (3.8x3.6mm); Value: 2K TRIMPOT; Footprint: Thunderscope_Rev5:BOU_3mm_POT
R? = CRCW12100000Z0EAHP: Resistor; Manufacturer_Name: Vishay; Datasheet Link: http://componentsearchengine.com/Datasheets/1/CRCW12100000Z0EAHP.pdf; Height: 0.7mm; Manufacturer_Part_Number: CRCW12100000Z0EAHP; Mouser Part Number: 71-CRCW12100000Z0EAH; Mouser Price/Stock: https://www.mouser.co.uk/ProductDetail/Vishay-Dale/CRCW12100000Z0EAHP?qs=40TFAHZMFvfh5Vmu%2FUuCPQ%3D%3D; Arrow Part Number: CRCW12100000Z0EAHP; Arrow Price/Stock: https://www.arrow.com/en/products/crcw12100000z0eahp/vishay?utm_currency=USD&region=nac
SHLD1000_4 = SHIELD 2118727-2: MANUFACTURER: TE Connectivity AMP; SUPPLIER 1: Mouser; SUPPLIER PART NUMBER 1: 571-2118727-2; MANUFACTURER PART NUMBER: 2118727-2; Value: 2118727-2
SHLD1001_4 = SHIELD 2118728-2: MANUFACTURER: TE Connectivity; Substitutions Policy: No Substitutions; SUPPLIER 1: Mouser; SUPPLIER PART NUMBER 1: 571-2118728-2; MANUFACTURER PART NUMBER: 2118728-2; PACKAGE: Surface Mount; Value: 2118728-2; Footprint: Thunderscope_Rev5:TE_2118728-2
TP1014_4 TP1015_4 TP1016_4 TP1017_4 TP1018_4 = TP PCB 1mm: Value: PCB; Footprint: Thunderscope_Rev5:GEN_TP_PCB
U1001_4 = IC SWITCH 3X SPDT TMUX4053: MANUFACTURER: Texas Instruments; MANUFACTURER PART NUMBER: TMUX4053DYYR; Substitutions Policy: No Substitutions; SUPPLIER 1: Texas Instruments; SUPPLIER PART NUMBER 1: TMUX4053DYYR; PACKAGE: 16-SOT-23-THIN; Value: TMUX4053; Footprint: Thunderscope_Rev5:TI_TSOT-23-16_DYY0016A
U1008_4 = IC PGA LMH6518: MANUFACTURER: Texas Instruments; MANUFACTURER PART NUMBER: LMH6518SQX/NOPB; Substitutions Policy: No Substitutions; SUPPLIER 1: Texas Instruments; SUPPLIER PART NUMBER 1: LMH6518SQX/NOPB; PACKAGE: 16-WQFN (4x4mm); Value: LMH6518; Footprint: Thunderscope_Rev5:TI_WQFN_RGH0016A
U1009_4 = IC BUFFER AMP BUF802: MANUFACTURER: Texas Instruments; MANUFACTURER PART NUMBER: BUF802IRGTR; Substitutions Policy: No Substitutions; SUPPLIER 1: Texas Instruments; SUPPLIER PART NUMBER 1: BUF802IRGTR; PACKAGE: 16-VQFN (3x3mm); Value: BUF802; Footprint: Thunderscope_Rev5:TI_VQFN_RGT0016C
U1011_4 = IC OPAMP OPA140: MANUFACTURER: Texas Instruments; Substitutions Policy: No Substitutions; SUPPLIER 1: Texas Instruments; SUPPLIER PART NUMBER 1: OPA140AIDBVR; MANUFACTURER PART NUMBER: OPA140AIDBVR; PACKAGE: SOT-23-5; Value: OPA140AIDBVR; Footprint: Thunderscope_Rev5:GEN_SOT23_5_950_2900X1600X1450
#FLG_4 = PWR_FLAG: Value: PWR_FLAG

## Sheet FPGA.SchDoc
size 297 x 209 mm
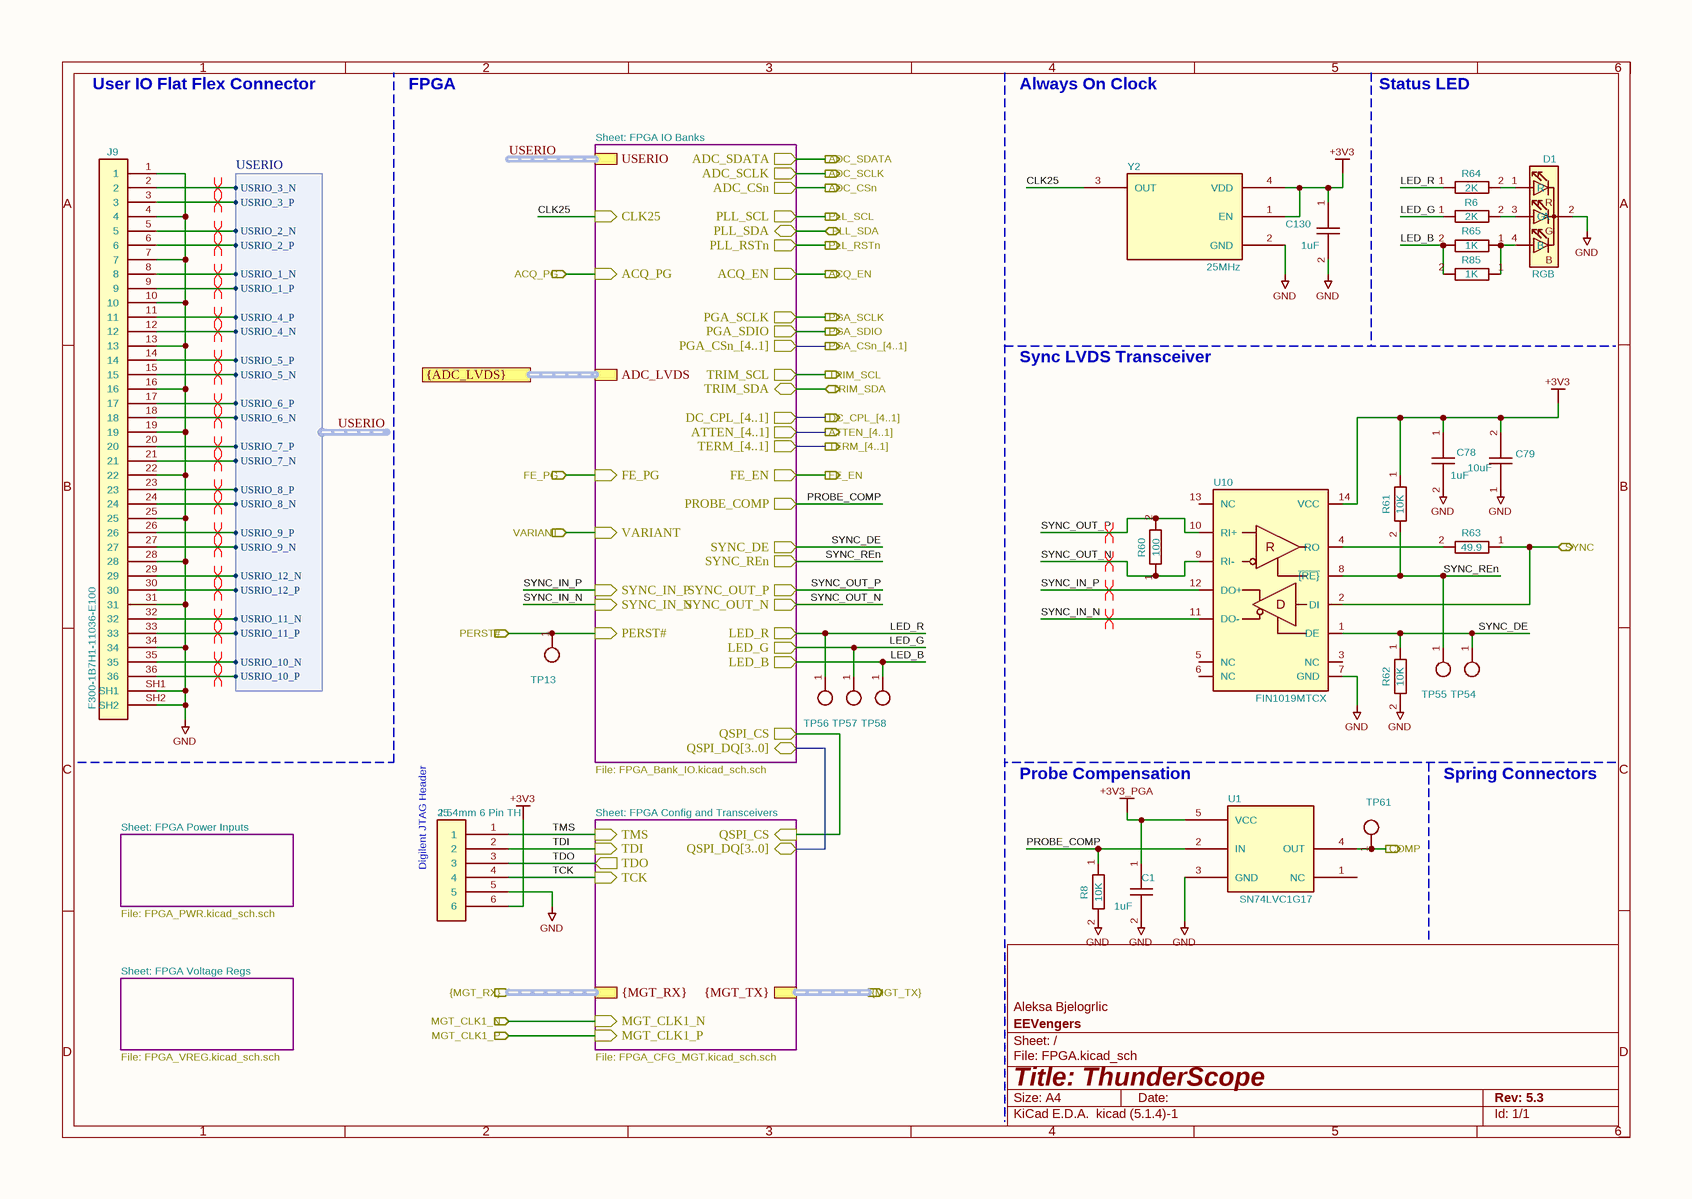
[diagram p3: FPGA.SchDoc]

### Parts
C1  1uF  [GEN_C_0402]
C78  1uF  [GEN_C_0402]
C79  10uF  [GEN_C_0603]
C130  1uF  [GEN_C_0402]
D1  RGB  [LED_Kingbright_APFA3010_3x1.5mm_Horizontal]
J5  2.54mm 6 Pin TH  [GEN_1.27MM_6_PIN_TH_RA]
J9  F300-1B7H1-11036-E100  [AMPHENOL_F300-1B7H1-11036-E100]
R6  2K  [GEN_R_0402]
R8  10K  [GEN_R_0402]
R60  100  [GEN_R_0402]
R61  10K  [GEN_R_0402]
R62  10K  [GEN_R_0402]
R63  49.9  [GEN_R_0402]
R64  2K  [GEN_R_0402]
R65  1K  [GEN_R_0402]
R85  1K  [GEN_R_0402]
TP13  PCB  [GEN_TP_PCB]  (value not drawn)
TP54  PCB  [GEN_TP_PCB]  (value not drawn)
TP55  PCB  [GEN_TP_PCB]  (value not drawn)
TP56  PCB  [GEN_TP_PCB]  (value not drawn)
TP57  PCB  [GEN_TP_PCB]  (value not drawn)
TP58  PCB  [GEN_TP_PCB]  (value not drawn)
TP61  PCB  [GEN_TP_PCB]  (value not drawn)
U1  SN74LVC1G17  [GEN_SC-70-5]
U10  FIN1019MTCX  [GEN_TSSOP-14_4.4x5mm_P0.65mm]
Y2  25MHz  [ECS_TXO-2016]

### Sub-sheets
FPGA Config and Transceivers = FPGA_CFG_MGT.SchDoc: TDI (in), TDO (out), TCK (in), TMS (in), QSPI_DQ[3..0] (bidir), QSPI_CS (in), MGT_CLK1_N (in), MGT_CLK1_P (in), {MGT_RX} (harness MGT_RX), {MGT_TX} (harness MGT_TX)
FPGA IO Banks = FPGA_Bank_IO.SchDoc: FE_EN (out), PROBE_COMP (out), PLL_RSTn (out), ATTEN_[4..1] (out), TERM_[4..1] (out), DC_CPL_[4..1] (out), PGA_CSn_[4..1] (out), ADC_CSn (out), PERST# (in), ADC_SDATA (out), ADC_SCLK (out), PLL_SCL (out), PLL_SDA (bidir), ACQ_EN (out), PGA_SCLK (out), PGA_SDIO (out), TRIM_SCL (out), TRIM_SDA (bidir), SYNC_OUT_N (out), SYNC_OUT_P (out), SYNC_IN_P (in), SYNC_IN_N (in), FE_PG (in), ACQ_PG (in), SYNC_DE (out), SYNC_REn (out), LED_R (out), LED_G (out), LED_B (out), CLK25 (in), QSPI_CS (out), QSPI_DQ[3..0] (bidir), VARIANT (in), USERIO (harness USERIO), ADC_LVDS (harness ADC_LVDS)
FPGA Power Inputs = FPGA_PWR.SchDoc: no entries
FPGA Voltage Regs = FPGA_VREG.SchDoc: no entries

### Ports
ACQ_EN (out), ACQ_PG (in), ADC_CSn (out), ADC_SCLK (out), ADC_SDATA (out), ATTEN_[4..1] (out), COMP (out), DC_CPL_[4..1] (out), FE_EN (out), FE_PG (in), MGT_CLK1_N (in), MGT_CLK1_P (in), PERST# (in), PGA_CSn_[4..1] (out), PGA_SCLK (out), PGA_SDIO (out), PLL_RSTn (out), PLL_SCL (out), PLL_SDA (bidir), SYNC (bidir), TERM_[4..1] (out), TRIM_SCL (out), TRIM_SDA (bidir), VARIANT (in), {ADC_LVDS}, {MGT_RX} (in), {MGT_TX} (out)

### Harnesses
USERIO: USRIO_1_P, USRIO_1_N, USRIO_2_P, USRIO_2_N, USRIO_3_P, USRIO_3_N, USRIO_4_P, USRIO_4_N, USRIO_5_P, USRIO_5_N, USRIO_6_P, USRIO_6_N, USRIO_7_P, USRIO_7_N, USRIO_8_P, USRIO_8_N, USRIO_9_P, USRIO_9_N, USRIO_10_P, USRIO_10_N, USRIO_11_P, USRIO_11_N, USRIO_12_P, USRIO_12_N

### Nets
+3V3: C78.1 C79.2 C130.1 J5.6 R61.1 U10.14(VCC) Y2.1(EN) Y2.4(VDD)
+3V3_PGA: C1.1 U1.5(VCC)
GND: C1.2 C78.2 C79.1 C130.2 D1.2(A) J5.5 J9.1 J9.4 J9.7 J9.10 J9.13 J9.16 J9.19 J9.22 J9.25 J9.28 J9.31 J9.34 J9.SH1 J9.SH2 R8.2 R62.2 U1.3(GND) U10.7(GND) Y2.2(GND)
ACQ_EN: port ACQ_EN, sheet FPGA IO Banks/ACQ_EN
ACQ_PG: port ACQ_PG, sheet FPGA IO Banks/ACQ_PG
ADC_CSn: port ADC_CSn, sheet FPGA IO Banks/ADC_CSn
ADC_SCLK: port ADC_SCLK, sheet FPGA IO Banks/ADC_SCLK
ADC_SDATA: port ADC_SDATA, sheet FPGA IO Banks/ADC_SDATA
CLK25: Y2.3(OUT) ; sheet FPGA IO Banks/CLK25
COMP: TP61.1 U1.4(OUT) ; port COMP
FE_EN: port FE_EN, sheet FPGA IO Banks/FE_EN
FE_PG: port FE_PG, sheet FPGA IO Banks/FE_PG
LED_B: R65.2 R85.2 TP58.1 ; sheet FPGA IO Banks/LED_B
LED_G: R6.1 TP57.1 ; sheet FPGA IO Banks/LED_G
LED_R: R64.1 TP56.1 ; sheet FPGA IO Banks/LED_R
MGT_CLK1_N: port MGT_CLK1_N, sheet FPGA Config and Transceivers/MGT_CLK1_N
MGT_CLK1_P: port MGT_CLK1_P, sheet FPGA Config and Transceivers/MGT_CLK1_P
PERST#: TP13.1 ; port PERST#, sheet FPGA IO Banks/PERST#
PGA_SCLK: port PGA_SCLK, sheet FPGA IO Banks/PGA_SCLK
PGA_SDIO: port PGA_SDIO, sheet FPGA IO Banks/PGA_SDIO
PLL_RSTn: port PLL_RSTn, sheet FPGA IO Banks/PLL_RSTn
PLL_SCL: port PLL_SCL, sheet FPGA IO Banks/PLL_SCL
PLL_SDA: port PLL_SDA, sheet FPGA IO Banks/PLL_SDA
PROBE_COMP: R8.1 U1.2(IN) ; sheet FPGA IO Banks/PROBE_COMP
QSPI_CS: sheet FPGA IO Banks/QSPI_CS, sheet FPGA Config and Transceivers/QSPI_CS
SYNC: R63.1 U10.2(DI) ; port SYNC
SYNC_DE: R62.1 TP54.1 U10.1(DE) ; sheet FPGA IO Banks/SYNC_DE
SYNC_IN_N: U10.11(DO-) ; sheet FPGA IO Banks/SYNC_IN_N
SYNC_IN_P: U10.12(DO+) ; sheet FPGA IO Banks/SYNC_IN_P
SYNC_OUT_N: R60.1 U10.9(RI-) ; sheet FPGA IO Banks/SYNC_OUT_N
SYNC_OUT_P: R60.2 U10.10(RI+) ; sheet FPGA IO Banks/SYNC_OUT_P
SYNC_REn: R61.2 TP55.1 U10.8(~{{RE}}) ; sheet FPGA IO Banks/SYNC_REn
TCK: J5.4 ; sheet FPGA Config and Transceivers/TCK
TDI: J5.2 ; sheet FPGA Config and Transceivers/TDI
TDO: J5.3 ; sheet FPGA Config and Transceivers/TDO
TMS: J5.1 ; sheet FPGA Config and Transceivers/TMS
TRIM_SCL: port TRIM_SCL, sheet FPGA IO Banks/TRIM_SCL
TRIM_SDA: port TRIM_SDA, sheet FPGA IO Banks/TRIM_SDA
USERIO.USRIO_1_N: J9.8 ; sheet FPGA IO Banks/USERIO.USRIO_1_N
USERIO.USRIO_1_P: J9.9 ; sheet FPGA IO Banks/USERIO.USRIO_1_P
USERIO.USRIO_2_N: J9.5 ; sheet FPGA IO Banks/USERIO.USRIO_2_N
USERIO.USRIO_2_P: J9.6 ; sheet FPGA IO Banks/USERIO.USRIO_2_P
USERIO.USRIO_3_N: J9.2 ; sheet FPGA IO Banks/USERIO.USRIO_3_N
USERIO.USRIO_3_P: J9.3 ; sheet FPGA IO Banks/USERIO.USRIO_3_P
USERIO.USRIO_4_N: J9.12 ; sheet FPGA IO Banks/USERIO.USRIO_4_N
USERIO.USRIO_4_P: J9.11 ; sheet FPGA IO Banks/USERIO.USRIO_4_P
USERIO.USRIO_5_N: J9.15 ; sheet FPGA IO Banks/USERIO.USRIO_5_N
USERIO.USRIO_5_P: J9.14 ; sheet FPGA IO Banks/USERIO.USRIO_5_P
USERIO.USRIO_6_N: J9.18 ; sheet FPGA IO Banks/USERIO.USRIO_6_N
USERIO.USRIO_6_P: J9.17 ; sheet FPGA IO Banks/USERIO.USRIO_6_P
USERIO.USRIO_7_N: J9.21 ; sheet FPGA IO Banks/USERIO.USRIO_7_N
USERIO.USRIO_7_P: J9.20 ; sheet FPGA IO Banks/USERIO.USRIO_7_P
USERIO.USRIO_8_N: J9.24 ; sheet FPGA IO Banks/USERIO.USRIO_8_N
USERIO.USRIO_8_P: J9.23 ; sheet FPGA IO Banks/USERIO.USRIO_8_P
USERIO.USRIO_9_N: J9.27 ; sheet FPGA IO Banks/USERIO.USRIO_9_N
USERIO.USRIO_9_P: J9.26 ; sheet FPGA IO Banks/USERIO.USRIO_9_P
USERIO.USRIO_10_N: J9.35 ; sheet FPGA IO Banks/USERIO.USRIO_10_N
USERIO.USRIO_10_P: J9.36 ; sheet FPGA IO Banks/USERIO.USRIO_10_P
USERIO.USRIO_11_N: J9.32 ; sheet FPGA IO Banks/USERIO.USRIO_11_N
USERIO.USRIO_11_P: J9.33 ; sheet FPGA IO Banks/USERIO.USRIO_11_P
USERIO.USRIO_12_N: J9.29 ; sheet FPGA IO Banks/USERIO.USRIO_12_N
USERIO.USRIO_12_P: J9.30 ; sheet FPGA IO Banks/USERIO.USRIO_12_P
VARIANT: port VARIANT, sheet FPGA IO Banks/VARIANT
NetD1_1: D1.1(R) R64.2
NetD1_3: D1.3(G) R6.2
NetD1_4: D1.4(B) R65.1 R85.1
NetR63_2: R63.2 U10.4(RO)

Not connected (* = marked no-connect by the designer): U1 1(NC); U10 3(NC) 5(NC) 6(NC) 13(NC)

### Buses and harness runs
bus port ATTEN_[4..1] = sheet FPGA IO Banks/ATTEN_[4..1]
bus port DC_CPL_[4..1] = sheet FPGA IO Banks/DC_CPL_[4..1]
bus port PGA_CSn_[4..1] = sheet FPGA IO Banks/PGA_CSn_[4..1]
bus port TERM_[4..1] = sheet FPGA IO Banks/TERM_[4..1]
bus sheet FPGA Config and Transceivers/QSPI_DQ[3..0] = sheet FPGA IO Banks/QSPI_DQ[3..0]
harness port {ADC_LVDS} = sheet FPGA IO Banks/ADC_LVDS
harness port {MGT_RX} = sheet FPGA Config and Transceivers/{MGT_RX}
harness port {MGT_TX} = sheet FPGA Config and Transceivers/{MGT_TX}
harness USERIO = sheet FPGA IO Banks/USERIO

### Layout directives
differential pair: SYNC_IN_N, SYNC_IN_P, SYNC_OUT_N, SYNC_OUT_P
differential pair; differential pair class USERIO: USERIO.USRIO_1_N, USERIO.USRIO_1_P, USERIO.USRIO_2_N, USERIO.USRIO_2_P, USERIO.USRIO_3_N, USERIO.USRIO_3_P, USERIO.USRIO_4_N, USERIO.USRIO_4_P, USERIO.USRIO_5_N, USERIO.USRIO_5_P, USERIO.USRIO_6_N, USERIO.USRIO_6_P, USERIO.USRIO_7_N, USERIO.USRIO_7_P, USERIO.USRIO_8_N, USERIO.USRIO_8_P, USERIO.USRIO_9_N, USERIO.USRIO_9_P, USERIO.USRIO_10_N, USERIO.USRIO_10_P, USERIO.USRIO_11_N, USERIO.USRIO_11_P, USERIO.USRIO_12_N, USERIO.USRIO_12_P

### Notes on the sheet
- User IO Flat Flex Connector
- FPGA
- Sheet: FPGA IO Banks
- Always On Clock
- Status LED
- Sync LVDS Transceiver
- File: FPGA_Bank_IO.kicad_sch.sch
- Probe Compensation
- Spring Connectors
- Sheet: FPGA Power Inputs
- Sheet: FPGA Config and Transceivers
- File: FPGA_PWR.kicad_sch.sch
- (near J5) Digilent JTAG Header
- Sheet: FPGA Voltage Regs
- File: FPGA_VREG.kicad_sch.sch
- File: FPGA_CFG_MGT.kicad_sch.sch
- 1
- 2
- 3
- 4
- 5
- 6
- A
- B
- C
- Aleksa Bjelogrlic
- D
- Title: ThunderScope
- File: FPGA.kicad_sch
- Sheet: /
- EEVengers
- KiCad E.D.A.  kicad (5.1.4)-1
- Size: A4
- Date:
- Rev: 5.3
- Id: 1/1
- (in symbol IC LVDS XCVR FIN1019MTCX) R; D

### Library data of the parts
C1 C78 C130 = CAP 1uF 25V X5R 0402: as C1009_4 on sheet FE_Channel; PACKAGE: 0402; SUPPLIER 1: Mouser; SUPPLIER PART NUMBER 1: 81-GRM155R61E105KA2D; Footprint: Thunderscope_Rev5:GEN_C_0402; Value: 1uF
C79 = CAP 10uF 25V X5R 0603: as C1003_4 on sheet FE_Channel; PACKAGE: 0402; SUPPLIER 1: Mouser; SUPPLIER PART NUMBER 1: 81-GRM188R61E106MA3D; Footprint: Thunderscope_Rev5:GEN_C_0603; Value: 10uF
D1 = LED RGB 1204 APFA3010LSEKJ3ZGKQBC: A-SP1103R6GHB1W-A01-2C; MANUFACTURER: Kingbright; Substitutions Policy: ECO Required for Substitution; SUPPLIER 1: Mouser; SUPPLIER PART NUMBER 1: 604-APFA3010LSEKJ3ZG; MANUFACTURER PART NUMBER: APFA3010LSEKJ3ZGKQBC; PACKAGE: 4-SMD; Value: RGB; Footprint: Thunderscope_Rev5:LED_Kingbright_APFA3010_3x1.5mm_Horizontal
J5 = CONN 2.54mm 6 Pin TH RA: MANUFACTURER: Wurth Electronics; MANUFACTURER PART NUMBER: 61300611021; Substitutions Policy: ECO Required for Substitution; SUPPLIER 1: Mouser; SUPPLIER PART NUMBER 1: 710-61300611021; PACKAGE: Through Hole; Value: 2.54mm 6 Pin TH; Footprint: Thunderscope_Rev5:GEN_2.54MM_6_PIN_TH_RA
J9 = CONN FFC BOTTOM 36POS 0.5MM RA: MANUFACTURER: Amphenol ICC; Substitutions Policy: No Substitutions; SUPPLIER 1: Mouser; SUPPLIER PART NUMBER 1: 649-F3001B7H111036E1; MANUFACTURER PART NUMBER: F300-1B7H1-11036-E100; PACKAGE: Surface Mount; Footprint: Thunderscope_Rev5:AMPHENOL_F300-1B7H1-11036-E100; Value: F300-1B7H1-11036-E100
R6 R64 = RES 2K OHM 1% 1/16W 0402: as R1043_4 on sheet FE_Channel; PACKAGE: 0402; SUPPLIER 1: Mouser; SUPPLIER PART NUMBER 1: 603-RC0402FR-072KL; Footprint: Thunderscope_Rev5:GEN_R_0402; Value: 2K
R8 R61 R62 = RES 10K OHM 1% 1/16W 0402: as R1029_4 on sheet FE_Channel; PACKAGE: 0402; SUPPLIER 1: Mouser; SUPPLIER PART NUMBER 1: 603-RC0402FR-0710KL; Footprint: Thunderscope_Rev5:GEN_R_0402; Value: 10K
R60 = RES 100 OHM 1% 1/10W 0402: MANUFACTURER: Yageo; MANUFACTURER PART NUMBER: RC0402FR-07100RL; TOLERANCE: 1%; Substitutions Policy: Any Parametric Equivalent; PACKAGE: 0402; SUPPLIER 1: Mouser; SUPPLIER PART NUMBER 1: 603-RC0402FR-07100RL; Footprint: Thunderscope_Rev5:GEN_R_0402; Value: 100
R63 = RES 49.9 OHM 1% 1/10W 0402: as R1037_4 on sheet FE_Channel; PACKAGE: 0402; SUPPLIER 1: Mouser; SUPPLIER PART NUMBER 1: 603-RC0402FR-0749R9L; Footprint: Thunderscope_Rev5:GEN_R_0402; Value: 49.9
R65 R85 = RES 1K OHM 1% 1/10W 0402: as R1001_4 on sheet FE_Channel; PACKAGE: 0402; SUPPLIER 1: Mouser; SUPPLIER PART NUMBER 1: 603-RC0402FR-071KL; Footprint: Thunderscope_Rev5:GEN_R_0402; Value: 1K
TP13 TP54-TP58 TP61 = TP PCB 1mm: Footprint: Thunderscope_Rev5:GEN_TP_PCB; Value: PCB
U1 = IC BUFFER SN74LVC1G17: MANUFACTURER: Texas Instruments; MANUFACTURER PART NUMBER: SN74LVC1G17DCKR; Substitutions Policy: ECO Required for Substitution; SUPPLIER 1: Texas Instruments; SUPPLIER PART NUMBER 1: SN74LVC1G17DCKR; PACKAGE: SC-70-5; Value: SN74LVC1G17; Footprint: Thunderscope_Rev5:GEN_SC-70-5
U10 = IC LVDS XCVR FIN1019MTCX: MANUFACTURER: onsemi; Substitutions Policy: No Substitutions; SUPPLIER 1: Mouser; SUPPLIER PART NUMBER 1: 512-FIN1019MTCX; MANUFACTURER PART NUMBER: FIN1019MTCX; PACKAGE: 14-TSSOP; Value: FIN1019MTCX; Footprint: Thunderscope_Rev5:GEN_TSSOP-14_4.4x5mm_P0.65mm
Y2 = OSC 25MHz ECS-TXO-2016: HOUSE PART NUMBER: ECS-TXO-2016-33-250-TR; MANUFACTURER: ECS International; Substitutions Policy: ECO Required for Substitution; SUPPLIER 1: Mouser; SUPPLIER PART NUMBER 1: 520-TXO-2016-33-250T; MANUFACTURER PART NUMBER: ECS-TXO-2016-33-250-TR; PACKAGE: 4-SMD (2.0x1.6mm); Value: 25MHz; Footprint: Thunderscope_Rev5:ECS_TXO-2016

## Sheet FPGA_PWR.SchDoc
size 297 x 209 mm
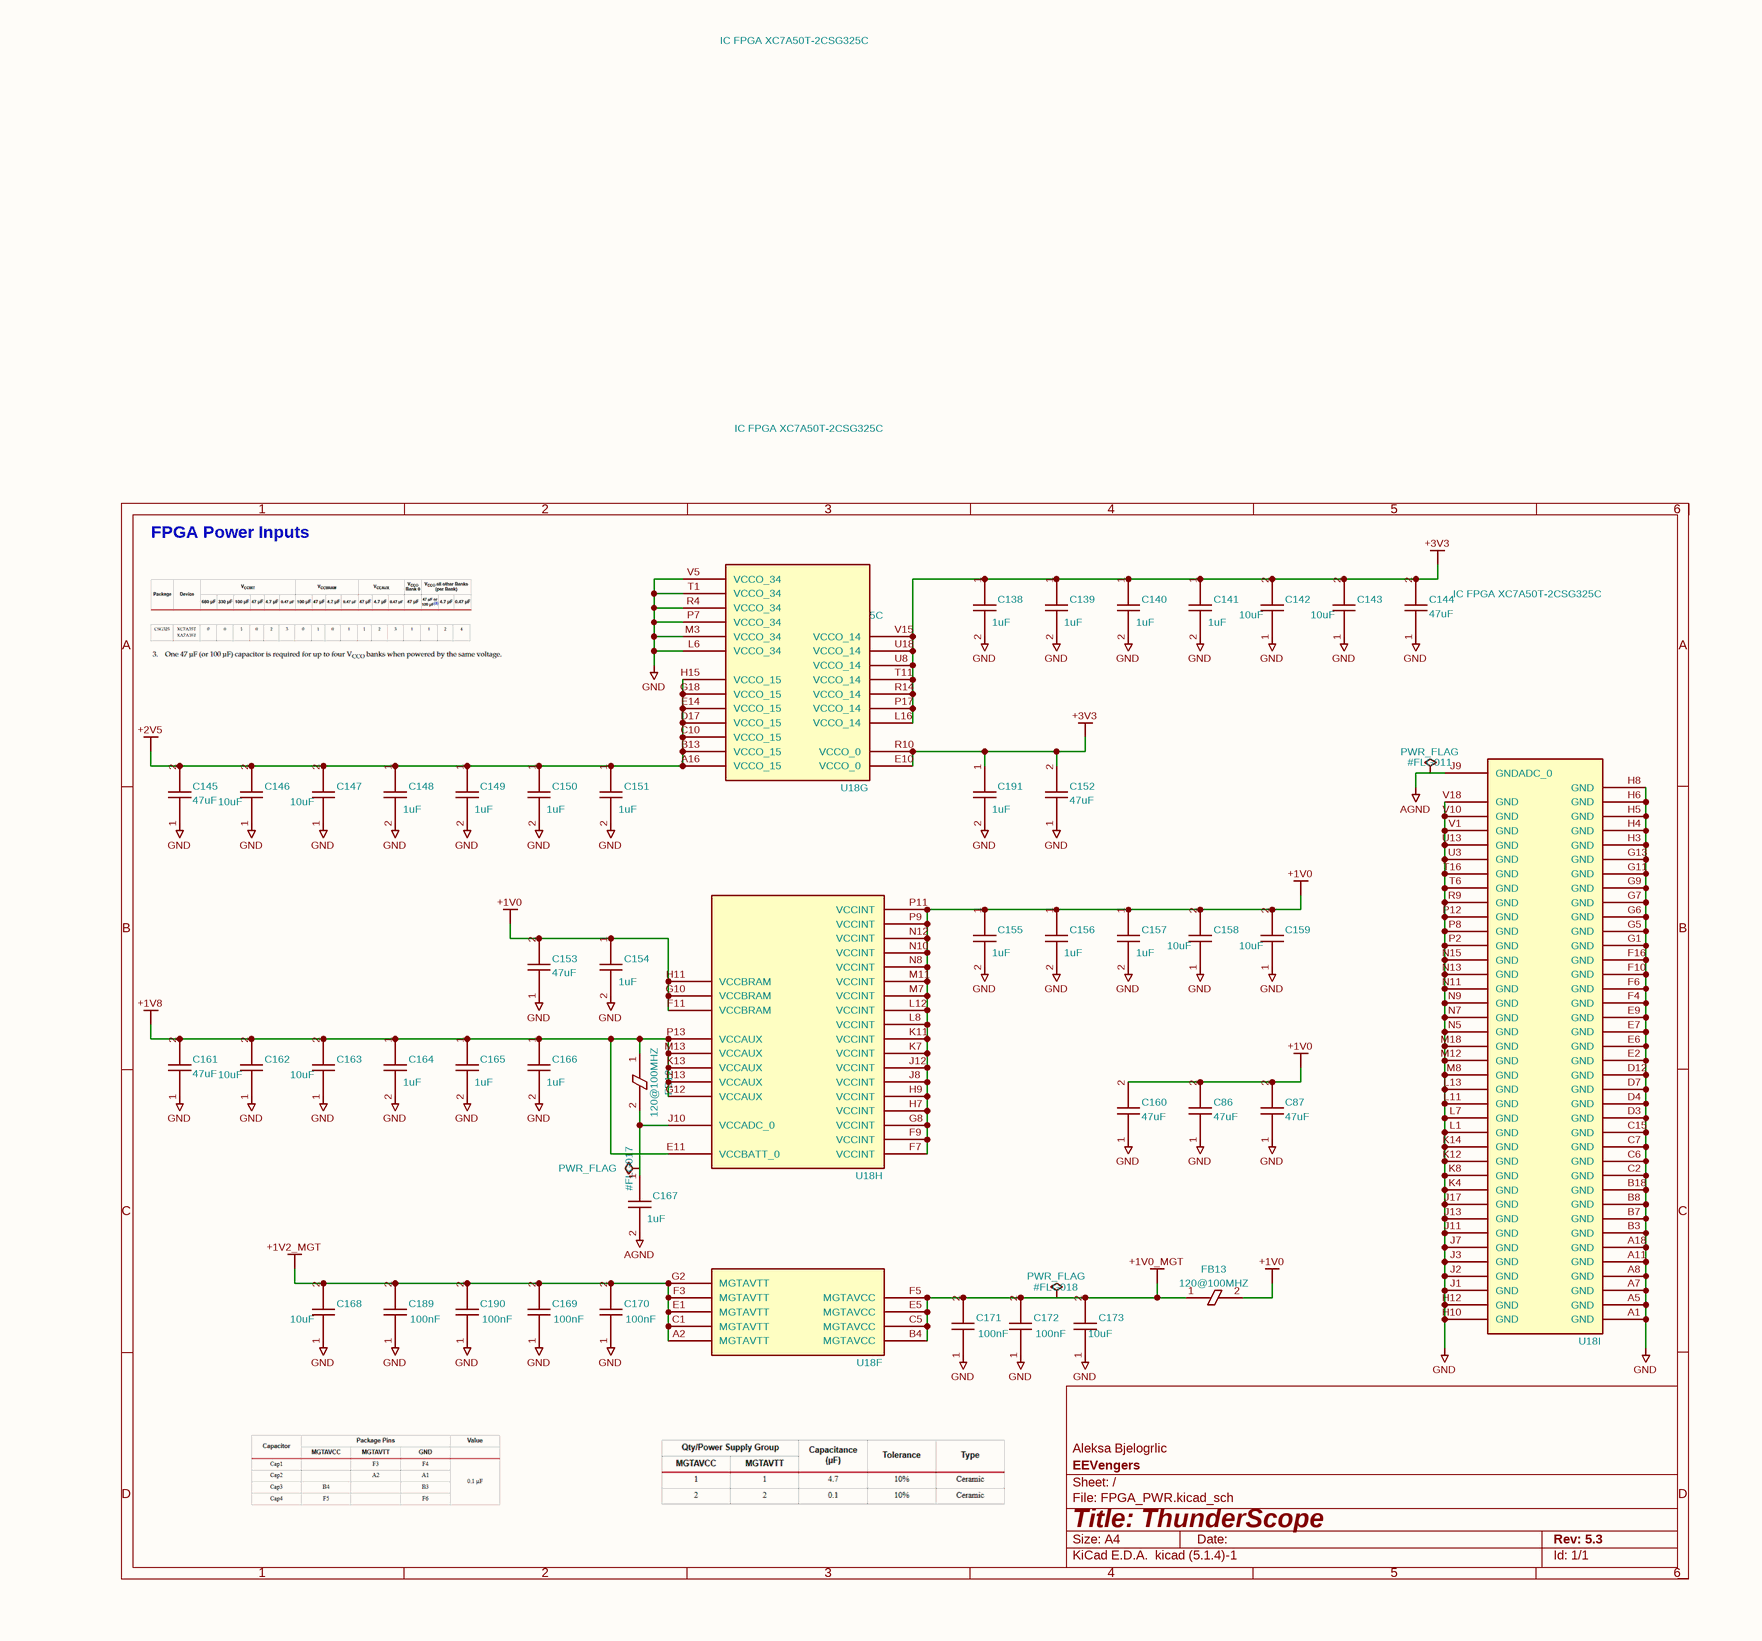
[diagram p4: FPGA_PWR.SchDoc]

### Parts
#FLG011  PWR_FLAG  (graphical)
#FLG017  PWR_FLAG  (graphical)
#FLG018  PWR_FLAG  (graphical)
C86  47uF  [GEN_C_0805]
C87  47uF  [GEN_C_0805]
C138  1uF  [GEN_C_0402]
C139  1uF  [GEN_C_0402]
C140  1uF  [GEN_C_0402]
C141  1uF  [GEN_C_0402]
C142  10uF  [GEN_C_0603]
C143  10uF  [GEN_C_0603]
C144  47uF  [GEN_C_0805]
C145  47uF  [GEN_C_0805]
C146  10uF  [GEN_C_0603]
C147  10uF  [GEN_C_0603]
C148  1uF  [GEN_C_0402]
C149  1uF  [GEN_C_0402]
C150  1uF  [GEN_C_0402]
C151  1uF  [GEN_C_0402]
C152  47uF  [GEN_C_0805]
C153  47uF  [GEN_C_0805]
C154  1uF  [GEN_C_0402]
C155  1uF  [GEN_C_0402]
C156  1uF  [GEN_C_0402]
C157  1uF  [GEN_C_0402]
C158  10uF  [GEN_C_0603]
C159  10uF  [GEN_C_0603]
C160  47uF  [GEN_C_0805]
C161  47uF  [GEN_C_0805]
C162  10uF  [GEN_C_0603]
C163  10uF  [GEN_C_0603]
C164  1uF  [GEN_C_0402]
C165  1uF  [GEN_C_0402]
C166  1uF  [GEN_C_0402]
C167  1uF  [GEN_C_0402]
C168  10uF  [GEN_C_0603]
C169  100nF  [GEN_C_0402]
C170  100nF  [GEN_C_0402]
C171  100nF  [GEN_C_0402]
C172  100nF  [GEN_C_0402]
C173  10uF  [GEN_C_0603]
C189  100nF  [GEN_C_0402]
C190  100nF  [GEN_C_0402]
C191  1uF  [GEN_C_0402]
FB12  120@100MHZ  [GEN_R_0402]
FB13  120@100MHZ  [GEN_R_0402]
U18  IC FPGA XC7A50T-2CSG325C  [XILINX_XC7A50T-2CSG325C]  (parts F,G,H,I of 9)

### Nets
+1V0: C86.2 C87.2 C153.2 C154.1 C155.1 C156.1 C157.1 C158.2 C159.2 C160.2 FB13.2 U18.F7(VCCINT) U18.F9(VCCINT) U18.F11(VCCBRAM) U18.G8(VCCINT) U18.G10(VCCBRAM) U18.H7(VCCINT) U18.H9(VCCINT) U18.H11(VCCBRAM) U18.J8(VCCINT) U18.J12(VCCINT) U18.K7(VCCINT) U18.K11(VCCINT) U18.L8(VCCINT) U18.L12(VCCINT) U18.M7(VCCINT) U18.M11(VCCINT) U18.N8(VCCINT) U18.N10(VCCINT) U18.N12(VCCINT) U18.P9(VCCINT) U18.P11(VCCINT)
+1V0_MGT: #FLG018.1 C171.2 C172.2 C173.2 FB13.1 U18.B4(MGTAVCC) U18.C5(MGTAVCC) U18.E5(MGTAVCC) U18.F5(MGTAVCC)
+1V2_MGT: C168.2 C169.2 C170.2 C189.2 C190.2 U18.A2(MGTAVTT) U18.C1(MGTAVTT) U18.E1(MGTAVTT) U18.F3(MGTAVTT) U18.G2(MGTAVTT)
+1V8: C161.2 C162.2 C163.2 C164.1 C165.1 C166.1 FB12.1 U18.E11(VCCBATT_0) U18.G12(VCCAUX) U18.H13(VCCAUX) U18.K13(VCCAUX) U18.M13(VCCAUX) U18.P13(VCCAUX)
+2V5: C145.2 C146.2 C147.2 C148.1 C149.1 C150.1 C151.1 U18.A16(VCCO_15) U18.B13(VCCO_15) U18.C10(VCCO_15) U18.D17(VCCO_15) U18.E14(VCCO_15) U18.G18(VCCO_15) U18.H15(VCCO_15)
+3V3: C138.1 C139.1 C140.1 C141.1 C142.2 C143.2 C144.2 C152.2 C191.1 U18.E10(VCCO_0) U18.L16(VCCO_14) U18.P17(VCCO_14) U18.R10(VCCO_0) U18.R14(VCCO_14) U18.T11(VCCO_14) U18.U8(VCCO_14) U18.U18(VCCO_14) U18.V15(VCCO_14)
AGND: #FLG011.1 C167.2 U18.J9(GNDADC_0)
GND: C86.1 C87.1 C138.2 C139.2 C140.2 C141.2 C142.1 C143.1 C144.1 C145.1 C146.1 C147.1 C148.2 C149.2 C150.2 C151.2 C152.1 C153.1 C154.2 C155.2 C156.2 C157.2 C158.1 C159.1 C160.1 C161.1 C162.1 C163.1 C164.2 C165.2 C166.2 C168.1 C169.1 C170.1 C171.1 C172.1 C173.1 C189.1 C190.1 C191.2 U18.A1(GND) U18.A5(GND) U18.A7(GND) U18.A8(GND) U18.A11(GND) U18.A18(GND) U18.B3(GND) U18.B7(GND) U18.B8(GND) U18.B18(GND) U18.C2(GND) U18.C6(GND) U18.C7(GND) U18.C15(GND) U18.D3(GND) U18.D4(GND) U18.D7(GND) U18.D12(GND) U18.E2(GND) U18.E6(GND) U18.E7(GND) U18.E9(GND) U18.F4(GND) U18.F6(GND) U18.F10(GND) U18.F16(GND) U18.G1(GND) U18.G5(GND) U18.G6(GND) U18.G7(GND) U18.G9(GND) U18.G11(GND) U18.G13(GND) U18.H3(GND) U18.H4(GND) U18.H5(GND) U18.H6(GND) U18.H8(GND) U18.H10(GND) U18.H12(GND) U18.J1(GND) U18.J2(GND) U18.J3(GND) U18.J7(GND) U18.J11(GND) U18.J13(GND) U18.J17(GND) U18.K4(GND) U18.K8(GND) U18.K12(GND) U18.K14(GND) U18.L1(GND) U18.L6(VCCO_34) U18.L7(GND) U18.L11(GND) U18.L13(GND) U18.M3(VCCO_34) U18.M8(GND) U18.M12(GND) U18.M18(GND) U18.N5(GND) U18.N7(GND) U18.N9(GND) U18.N11(GND) U18.N13(GND) U18.N15(GND) U18.P2(GND) U18.P7(VCCO_34) U18.P8(GND) U18.P12(GND) U18.R4(VCCO_34) U18.R9(GND) U18.T1(VCCO_34) U18.T6(GND) U18.T16(GND) U18.U3(GND) U18.U13(GND) U18.V1(GND) U18.V5(VCCO_34) U18.V10(GND) U18.V18(GND)
Net#FLG017_1: #FLG017.1 C167.1 FB12.2 U18.J10(VCCADC_0)

### Notes on the sheet
- FPGA Power Inputs
- 1
- 2
- 3
- 4
- 5
- 6
- A
- B
- C
- Aleksa Bjelogrlic
- D
- Title: ThunderScope
- File: FPGA_PWR.kicad_sch
- Sheet: /
- EEVengers
- KiCad E.D.A.  kicad (5.1.4)-1
- Size: A4
- Date:
- Rev: 5.3
- Id: 1/1

### Library data of the parts
C86 C87 C144 C145 C152 C153 C160 C161 = CAP 47uF 6.3V X5R 0805: HOUSE PART NUMBER: C-47uF-0805-002; MANUFACTURER: Samsung; MANUFACTURER PART NUMBER: CL21A476MQYNNNE; VOLTAGE RATING: 6.3V; Substitutions Policy: Any Parametric Equivalent; PACKAGE: 0805; SUPPLIER 1: Mouser; SUPPLIER PART NUMBER 1: 187-CL32A226KPJNNNE; Footprint: Thunderscope_Rev5:GEN_C_0805; Value: 47uF
C138-C141 C148-C151 C154-C157 C164-C167 C191 = CAP 1uF 25V X5R 0402: as C1009_4 on sheet FE_Channel; PACKAGE: 0402; SUPPLIER 1: Mouser; SUPPLIER PART NUMBER 1: 81-GRM155R61E105KA2D; Footprint: Thunderscope_Rev5:GEN_C_0402; Value: 1uF
C142 C143 C146 C147 C158 C159 C162 C163 C168 C173 = CAP 10uF 25V X5R 0603: as C1003_4 on sheet FE_Channel; PACKAGE: 0402; SUPPLIER 1: Mouser; SUPPLIER PART NUMBER 1: 81-GRM188R61E106MA3D; Footprint: Thunderscope_Rev5:GEN_C_0603; Value: 10uF
C169-C172 C189 C190 = CAP 100nF 16V X7R 0402: as C1032_4 on sheet FE_Channel; PACKAGE: 0402; SUPPLIER 1: Mouser; SUPPLIER PART NUMBER 1: 81-GCM155R71C104KA5D; Footprint: Thunderscope_Rev5:GEN_C_0402; Value: 100nF
FB12 FB13 = FERRITE BEAD 120 OHM 0402: as FB1000_4 on sheet FE_Channel; SUPPLIER 1: Mouser; SUPPLIER PART NUMBER 1: 81-BLM15PX121SN1D; MANUFACTURER PART NUMBER: BLM15PX121SN1D; PACKAGE: 0402; Footprint: Thunderscope_Rev5:GEN_R_0402; Value: 120@100MHZ
U18 = IC FPGA XC7A50T-2CSG325C: MANUFACTURER: Xilinx; Substitutions Policy: No Substitutions; HOUSE PART NUMBER: XC7A50T-2CSG325C; MANUFACTURER PART NUMBER: XC7A50T-2CSG325C; SUPPLIER 1: Digi-Key; SUPPLIER PART NUMBER 1: 122-2193-ND; PACKAGE: 324-BGA (15x15mm); Value: IC FPGA XC7A50T-2CSG325C; Footprint: Thunderscope_Rev5:XILINX_XC7A50T-2CSG325C
#FLG011 #FLG017 #FLG018 = PWR_FLAG: Value: PWR_FLAG